# Altium project Analizador_trifasico_IoT_pcb.PrjPcb (part 1 of 2)
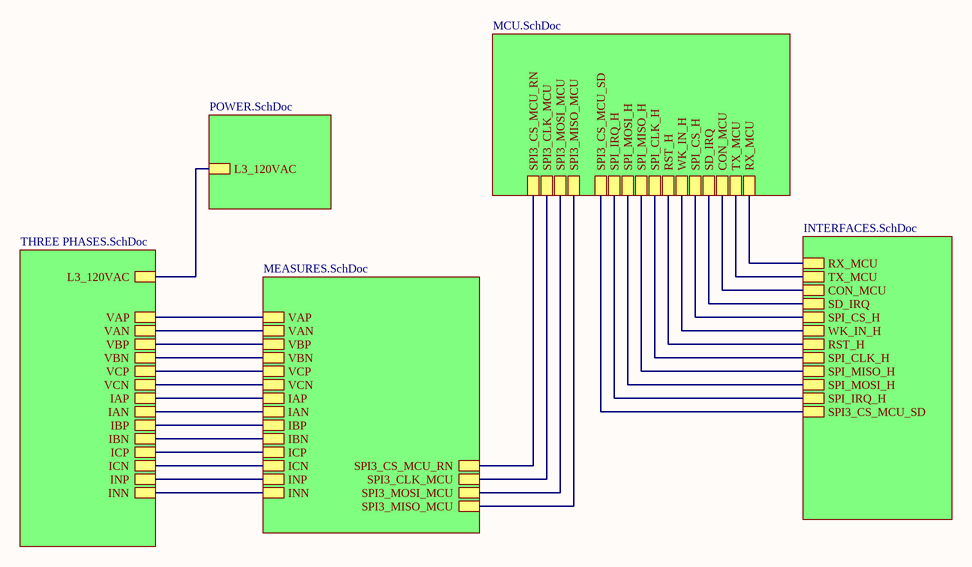
[diagram p0: MAIN.SchDoc]
6 sheets, 151 parts. Net scope: hierarchical (ports join the sheet entries above them; power ports are global).
Board file: Analizador_PCB.PcbDoc
Sheets:
  MAIN.SchDoc
    Designator = MEASURES.SchDoc
    Designator = POWER.SchDoc
    Designator = THREE PHASES.SchDoc
    Designator = MCU.SchDoc
    Designator = INTERFACES.SchDoc

## Sheet MAIN.SchDoc
size A4; SheetNumber: 1; SheetTotal: 6

### Sub-sheets
Designator = MEASURES.SchDoc: VAP, VAN, VBP, VBN, VCP, VCN, IAP, IAN, IBP, IBN, ICP, ICN, INP, INN, SPI3_MISO_MCU, SPI3_MOSI_MCU, SPI3_CLK_MCU, SPI3_CS_MCU_RN
Designator = POWER.SchDoc: L3_120VAC
Designator = THREE PHASES.SchDoc: VAP, VAN, VBP, VBN, VCP, VCN, IAP, IAN, IBP, IBN, ICP, ICN, INP, INN, L3_120VAC
Designator = MCU.SchDoc: SPI_IRQ_H, SPI_MOSI_H, SPI_MISO_H, SPI_CLK_H, RST_H, WK_IN_H, SPI_CS_H, CON_MCU, TX_MCU, RX_MCU, SPI3_CLK_MCU, SPI3_MOSI_MCU, SPI3_MISO_MCU, SD_IRQ, SPI3_CS_MCU_SD, SPI3_CS_MCU_RN
Designator = INTERFACES.SchDoc: TX_MCU, CON_MCU, RX_MCU, SPI_CS_H, SPI_MISO_H, WK_IN_H, RST_H, SPI_CLK_H, SPI_MOSI_H, SPI_IRQ_H, SD_IRQ, SPI3_CS_MCU_SD

### Nets
L3_120VAC: sheet Designator/L3_120VAC, sheet Designator/L3_120VAC
SPI_CLK_H: sheet Designator/SPI_CLK_H, sheet Designator/SPI_CLK_H
SPI_MISO_H: sheet Designator/SPI_MISO_H, sheet Designator/SPI_MISO_H
SPI_MOSI_H: sheet Designator/SPI_MOSI_H, sheet Designator/SPI_MOSI_H
Net500_1: sheet Designator/RST_H, sheet Designator/RST_H
Net500_2: sheet Designator/WK_IN_H, sheet Designator/WK_IN_H
Net500_3: sheet Designator/SPI_IRQ_H, sheet Designator/SPI_IRQ_H
Net500_4: sheet Designator/SPI_CS_H, sheet Designator/SPI_CS_H
NetC300_2: sheet Designator/IAP, sheet Designator/IAP
NetC301_1: sheet Designator/IAN, sheet Designator/IAN
NetC302_2: sheet Designator/VAP, sheet Designator/VAP
NetC303_1: sheet Designator/VAN, sheet Designator/VAN
NetC304_2: sheet Designator/IBP, sheet Designator/IBP
NetC305_1: sheet Designator/IBN, sheet Designator/IBN
NetC306_2: sheet Designator/VBP, sheet Designator/VBP
NetC307_1: sheet Designator/VBN, sheet Designator/VBN
NetC308_2: sheet Designator/ICP, sheet Designator/ICP
NetC309_2: sheet Designator/VCP, sheet Designator/VCP
NetC310_1: sheet Designator/ICN, sheet Designator/ICN
NetC311_1: sheet Designator/VCN, sheet Designator/VCN
NetC312_2: sheet Designator/INP, sheet Designator/INP
NetC313_1: sheet Designator/INN, sheet Designator/INN
NetR500_2: sheet Designator/CON_MCU, sheet Designator/CON_MCU
NetR503_1: sheet Designator/SPI3_CS_MCU_SD, sheet Designator/SPI3_CS_MCU_SD
NetR507_2: sheet Designator/SD_IRQ, sheet Designator/SD_IRQ
NetU101_3: sheet Designator/SPI3_MOSI_MCU, sheet Designator/SPI3_MOSI_MCU
NetU101_4: sheet Designator/SPI3_CS_MCU_RN, sheet Designator/SPI3_CS_MCU_RN
NetU101_5: sheet Designator/SPI3_CLK_MCU, sheet Designator/SPI3_CLK_MCU
NetU101_6: sheet Designator/SPI3_MISO_MCU, sheet Designator/SPI3_MISO_MCU
NetU401_10: sheet Designator/TX_MCU, sheet Designator/TX_MCU
NetU401_11: sheet Designator/RX_MCU, sheet Designator/RX_MCU

## Sheet MEASURES.SchDoc
size A4; SheetNumber: 4; SheetTotal: 6
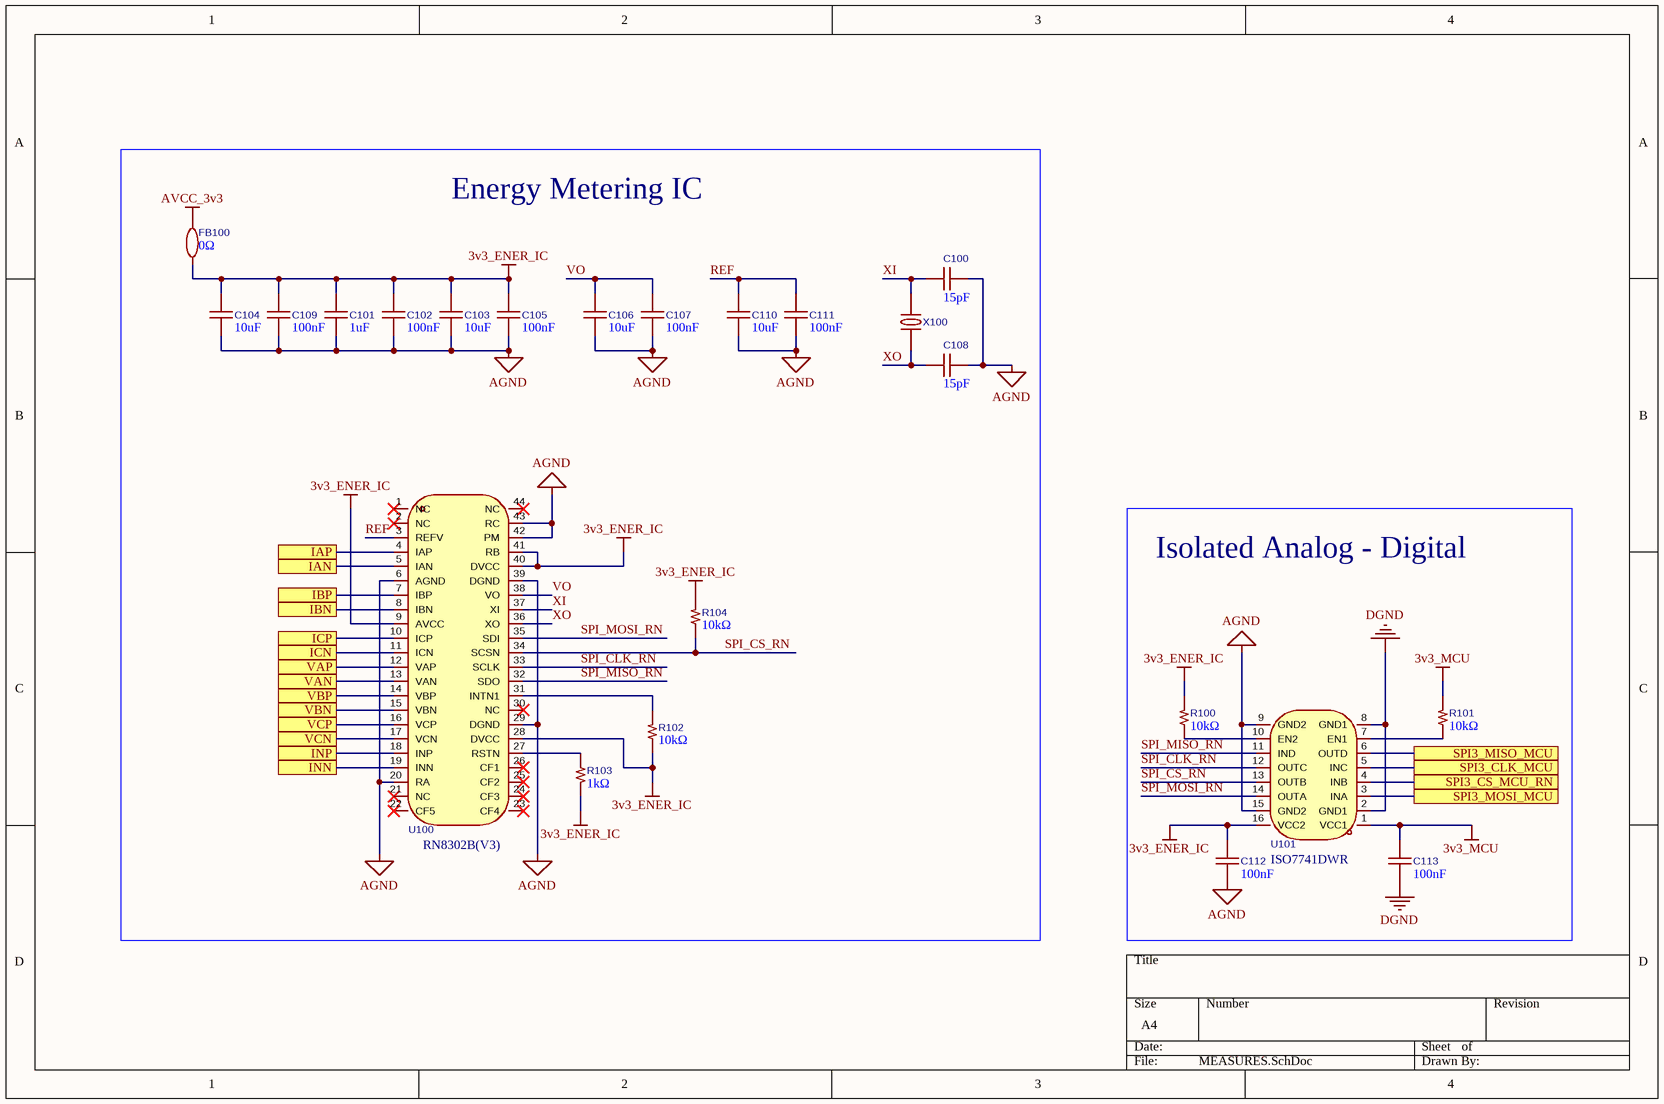
[diagram p1: MEASURES.SchDoc]

### Parts
C100  value 15pF  [0603_cap]  (hidden comment: YAGEO CC0603JRNPO9BN150)
C101  value 1uF  [0603_cap]  (hidden comment: CL10B105KB8NQNC)
C102  value 100nF  [0603_cap]  (hidden comment: AIDE CAPACITOR 0603X7R104K250NT)
C103  value 10uF  [0805_cap]  (hidden comment: muRata GRM21BR61C106KE15L)
C104  value 10uF  [0805_cap]  (hidden comment: muRata GRM21BR61C106KE15L)
C105  value 100nF  [0603_cap]  (hidden comment: AIDE CAPACITOR 0603X7R104K250NT)
C106  value 10uF  [0805_cap]  (hidden comment: muRata GRM21BR61C106KE15L)
C107  value 100nF  [0603_cap]  (hidden comment: AIDE CAPACITOR 0603X7R104K250NT)
C108  value 15pF  [0603_cap]  (hidden comment: YAGEO CC0603JRNPO9BN150)
C109  value 100nF  [0603_cap]  (hidden comment: AIDE CAPACITOR 0603X7R104K250NT)
C110  value 10uF  [0805_cap]  (hidden comment: muRata GRM21BR61C106KE15L)
C111  value 100nF  [0603_cap]  (hidden comment: AIDE CAPACITOR 0603X7R104K250NT)
C112  value 100nF  [0603_cap]  (hidden comment: AIDE CAPACITOR 0603X7R104K250NT)
C113  value 100nF  [0603_cap]  (hidden comment: AIDE CAPACITOR 0603X7R104K250NT)
FB100  value 0Ω  [0603_cap]  (hidden comment: Yanchuang SCBM160808U090T)
R100  value 10kΩ  [0603_RES]  (hidden comment: SAE 1RC0603F1002)
R101  value 10kΩ  [0603_RES]  (hidden comment: SAE 1RC0603F1002)
R102  value 10kΩ  [0603_RES]  (hidden comment: SAE 1RC0603F1002)
R103  value 1kΩ  [0603_RES]  (hidden comment: FOJAN FRC0603F1001TS)
R104  value 10kΩ  [0603_RES]  (hidden comment: SAE 1RC0603F1002)
U100  RN8302B(v3)  [3]
U101  C571196  [SOIC-16_L10.3-W7.5-P1.27-LS10.3-BL]  (value not drawn)
X100  049ss2-8.192f12dzlal  [HC-49S_L11.4-W4.7-LS12.7]  (value not drawn)

### Blocks framed on the sheet
Energy Metering IC: C100-C111 FB100 R102-R104 U100 X100
Isolated Analog - Digital: C112 C113 R100 R101 U101

### Ports
IAN (see MAIN[2C], THREE PHASES[4B]), IAP (see MAIN[2C], THREE PHASES[4A]), IBN (see MAIN[2C], THREE PHASES[4B]), IBP (see MAIN[2C], THREE PHASES[4B]), ICN (see MAIN[2C], THREE PHASES[4C]), ICP (see MAIN[2C], THREE PHASES[4C]), INN (see MAIN[2C], THREE PHASES[4D]), INP (see MAIN[2C], THREE PHASES[4C]), SPI3_CLK_MCU (see MAIN[2C], MCU[3C]), SPI3_CS_MCU_RN (see MAIN[2C], MCU[3C]), SPI3_MISO_MCU (see MAIN[2C], MCU[3C]), SPI3_MOSI_MCU (see MAIN[2C], MCU[3C]), VAN (see MAIN[2B], THREE PHASES[3B]), VAP (see MAIN[2B], THREE PHASES[3B]), VBN (see MAIN[2B], THREE PHASES[3C]), VBP (see MAIN[2B], THREE PHASES[3B]), VCN (see MAIN[2B], THREE PHASES[3C]), VCP (see MAIN[2B], THREE PHASES[3C])

### Nets
3v3_ENER_IC: C101.2 C102.2 C103.2 C104.2 C105.2 C109.2 C112.2 FB100.1 R100.2 R102.1 R103.2 R104.2 U100.9(AVCC) U100.28(DVCC) U100.40(DVCC) U100.41(RB) U101.16(VCC2)
3v3_MCU: C113.2 R101.2 U101.1(VCC1)
AGND: C100.1 C101.1 C102.1 C103.1 C104.1 C105.1 C106.1 C107.1 C108.1 C109.1 C110.1 C111.1 C112.1 U100.6(AGND) U100.20(RA) U100.29(DGND) U100.39(DGND) U100.42(PM) U100.43(RC) U101.9(GND2) U101.15(GND2)
AVCC_3v3: FB100.2
DGND: C113.1 U101.2(GND1) U101.8(GND1)
REF: C110.2 C111.2 U100.3(REFV)
SPI_CLK_RN: U100.33(SCLK) U101.12(OUTC)
SPI_CS_RN: R104.1 U100.34(SCSN) U101.13(OUTB)
SPI_MISO_RN: U100.32(SDO) U101.11(IND)
SPI_MOSI_RN: U100.35(SDI) U101.14(OUTA)
VO: C106.2 C107.2 U100.38(VO)
XI: C100.2 U100.37(XI) X100.1
XO: C108.2 U100.36(XO) X100.2
NetC300_2: U100.4(IAP) ; port IAP
NetC301_1: U100.5(IAN) ; port IAN
NetC302_2: U100.12(VAP) ; port VAP
NetC303_1: U100.13(VAN) ; port VAN
NetC304_2: U100.7(IBP) ; port IBP
NetC305_1: U100.8(IBN) ; port IBN
NetC306_2: U100.14(VBP) ; port VBP
NetC307_1: U100.15(VBN) ; port VBN
NetC308_2: U100.10(ICP) ; port ICP
NetC309_2: U100.16(VCP) ; port VCP
NetC310_1: U100.11(ICN) ; port ICN
NetC311_1: U100.17(VCN) ; port VCN
NetC312_2: U100.18(INP) ; port INP
NetC313_1: U100.19(INN) ; port INN
NetR100_1: R100.1 U101.10(EN2)
NetR101_1: R101.1 U101.7(EN1)
NetR102_2: R102.2 U100.31(INTN1)
NetR103_1: R103.1 U100.27(RSTN)
NetU101_3: U101.3(INA) ; port SPI3_MOSI_MCU
NetU101_4: U101.4(INB) ; port SPI3_CS_MCU_RN
NetU101_5: U101.5(INC) ; port SPI3_CLK_MCU
NetU101_6: U101.6(OUTD) ; port SPI3_MISO_MCU

Not connected (* = marked no-connect by the designer): U100 1(NC)* 2(NC)* 21(NC)* 22(CF5)* 23(CF4)* 24(CF3)* 25(CF2)* 26(CF1)* 30(NC)* 44(NC)*

### Library data of the parts
C100 C108 = CAP CER 15pF 50V NP0 0603: Capacitance:15pF Tolerance:±5% Tolerance:±5% Voltage Rating:50V Temperature Coefficient:C0G; Manufacturer 1: Chinocera; Manufacturer Part Number 1: HGC0603G0150J500NTHJ; ComponentLink1Description: LCSC; ComponentLink1URL: https://www.lcsc.com/product-detail/C465156.html?s_z=n_q_HGC0603G0150J500NTHJ; Supplier 1: LCSC; Supplier Part Number 1: C465156
C101 = CAP CER 1uF 50V X7R 0603: Capacitance:1uF Tolerance:±20% Tolerance:±20% Voltage Rating:50V Ripple Current:- Equivalent Series Resistance(ESR):- Diameter:4mm Height - Seated (Max):5.4mm Lifetime:1000hrs@105℃ Operating Temperature:-45℃~+105℃ Operating Temperature:-45℃~+105℃; Manufacturer 1: Samsung Electro-Mechanics; ComponentLink1Description: LCSC; ComponentLink1URL: https://www.lcsc.com/es/product-detail/C5199872.html?spm=wm.fly.bg.9.xh&lcsc_vid=ElBYBFACR1JaVQdSQ1NeBFwHFAdfUFIFEwUNXlwCEVQxVlNfRlVWUFNWT1hWUDtW; Supplier 1: LSCS; Supplier Part Number 1: C5199872; Manufacturer Part Number 1: CL10B105KB8NQNC
C102 C105 C107 C109 C111-C113 = CAP CER 100nF 25V X7R 0603: ComponentLink1Description: LCSC; ComponentLink1URL: https://www.lcsc.com/product-detail/C465156.html?s_z=n_q_HGC0603G0150J500NTHJ; Supplier 1: LCSC; Manufacturer 1: AIDE CAPACITOR; Manufacturer Part Number 1: 0603X7R104K250NT; Supplier Part Number 1: C48579280
C103 C104 C106 C110 = CAP CER 10uF 16V X5R 0805: ComponentLink1Description: New link; ComponentLink1URL: https://www.lcsc.com/es/product-detail/C77075.html?spm=wm.fly.bg.11.xh___wm.fly.dhl.mly.13-0-3&lcsc_vid=ElBYBFACR1JaVQdSQ1NeBFwHFAdfUFIFEwUNXlwCEVQxVlNfRlVWUFNWT1hWUDtW; Manufacturer 1: muRata; Manufacturer Part Number 1: GRM21BR61C106KE15L; Supplier Part Number 1: C77075; Supplier 1: LCSC
FB100 = FERR_10mohms 15o@100MHz: 10mΩ 15Ω@100MHz 0603 Ferrite Beads and Chips; ComponentLink1Description: LCSC; ComponentLink1URL: https://www.lcsc.com/es/product-detail/C52205324.html?s_z=s_c_Ferrite%2520Beads%2520and%2520Chips&spm=wm.fly.bg.0.xh&lcsc_vid=T1EMUlBeR1ALUlVSFANeUFcFR1BWV1EHFVFaA1dQElAxVlNfRlJaVFNSQlhYUjsOAxUeFF5JWBYZEEoKFBINSQcJGk4LFEsFFhULAAsUDk5fVlNWWQkaCgg%3D; Supplier 1: LCSC; Supplier Part Number 1: C52205324; Manufacturer 1: Yanchuang; Manufacturer Part Number 1: SCBM160808U090T
R100-R102 R104 = RES_10kohms 100mW 75V: 10kΩ 100mW 75V Thick Film Resistor ±100ppm/℃ ±1% 0603 Chip Resistor - Surface Mount; ComponentLink1Description: New link; ComponentLink1URL: https://www.lcsc.com/es/product-detail/C53224186.html?spm=wm.fly.bg.4.xh___wm.fly.dhl.mly.13-6-1&lcsc_vid=T1EMUlBeR1ALUlVSFANeUFcFR1BWV1EHFVFaA1dQElAxVlNfRlJaV1FUQldbXzsOAxUeFF5JWBYZEEoKFBINSQcJGk4NBhYS; Manufacturer 1: SAE; Manufacturer Part Number 1: 1RC0603F1002; Supplier Part Number 1: C53224186; Supplier 1: LCSC
R103 = RES 1kohms ±1% 100mW 0603: RES 1kΩ ±1% 100mW 0603; ComponentLink1Description: New link; ComponentLink1URL: https://www.lcsc.com/es/product-detail/C2907002.html?spm=wm.fly.bg.1.xh___wm.fly.dhl.mly.13-6-1&lcsc_vid=T1EMUlBeR1ALUlVSFANeUFcFR1BWV1EHFVFaA1dQElAxVlNfRlJaV1FUQldbXzsOAxUeFF5JWBYZEEoKFBINSQcJGk4NBhYS; Supplier 1: LCSC; Supplier Part Number 1: C2907002; Manufacturer Part Number 1: FRC0603F1001TS; Manufacturer 1: FOJAN
U100 = RN8302B(v3): Meter Type:Polyphase Energy Metering IC Number of Channels:- Tolerance:0.1% Voltage - Supply:3V~3.6V Voltage - Supply:3V~3.6V Dynamic Range:10000:1 Interface:SPI Current - Supply:4.4mA Current - Supply:4.4mA Operating Temperature:-40℃~+85℃ Operating Tempe; Manufacturer 1: RENERGY; ComponentLink1Description: LCSC; ComponentLink1URL: https://www.lcsc.com/es/product-detail/C22381391.html?s_z=n_q_rn8302b%28v3%29&spm=wm.fly.bg.0.xh&lcsc_vid=FFRdVwAETgNbVwAHTlRdV1UFEwcIU1ZXQVZZAlYFQAcxVlNfRlJdUlFTRVNXXzsOAxUeFF5JWBYZEEoKFBINSQcJGk4LFEsWBQ4KEgcSWgULEwUPG04tU1VSTllfSQwSGg0%3D; Supplier 1: LCSC; Supplier Part Number 1: C22381391; Manufacturer Part Number 1: RN8302B(V3)
U101 = iso7741dwr: Number of Forward Channels:3 Number of Reverse Channels:1 Data Rate(Max):100Mbps Default Output:High Level Isolation Voltage(Vrms):5000 CMTI(kV/us):100kV/us Propagation Delay(tpd):10.7ns Features:Channel direction configurable；Fail-safe output Voltage - S; Manufacturer 1: TI; ComponentLink1Description: LCSC; ComponentLink1URL: https://www.lcsc.com/es/product-detail/C571196.html?s_z=n_q_iso7741dwr&spm=wm.fly.bg.0.xh&lcsc_vid=FFRdVwAETgNbVwAHTlRdV1UFEwcIU1ZXQVZZAlYFQAcxVlNfRlJdUlZUQVBeVTsOAxUeFF5JWBYZEEoKFBINSQcJGk4LFEsWBQ4KEgcSWgULEwUPG04tUlZRQ1deXlZIHxUDCw%3D%3D; Supplier 1: LCSC; Supplier Part Number 1: C571196; Manufacturer Part Number 1: ISO7741DWR
X100 = Crystal_049ss2: Type:Crystal Oscillator Frequency:8.192MHz Normal temperature Frequency Tolerance:±20ppm Normal temperature Frequency Tolerance:±20ppm Load Capacitance:12pF Frequency Stability:±100ppm Frequency Stability:±100ppm Equivalent Series Resistance(ESR):60Ω Oper; Manufacturer 1: HCI; Value: 8.192MHz; Operating Temperature: -40℃~+125℃; ComponentLink1Description: LCSC; ComponentLink1URL: https://www.lcsc.com/es/product-detail/C19674267.html?s_z=n_q_049ss2-8.192f12dzlal&spm=wm.fly.bg.0.xh&lcsc_vid=FFRdVwAETgNbVwAHTlRdV1UFEwcIU1ZXQVZZAlYFQAcxVlNfRlJdU11WRldaVDsOAxUeFF5JWBYZEEoKFBINSQcJGk4LFEsWBQ4KEgcSWgULEwUPG04tUFBVQVZZVEoOAwwC; Supplier 1: LCSC; Supplier Part Number 1: C19674267; Manufacturer Part Number 1: 049SS2-8.192F12DZLAL

## Sheet POWER.SchDoc
size A4; SheetNumber: 3; SheetTotal: 6
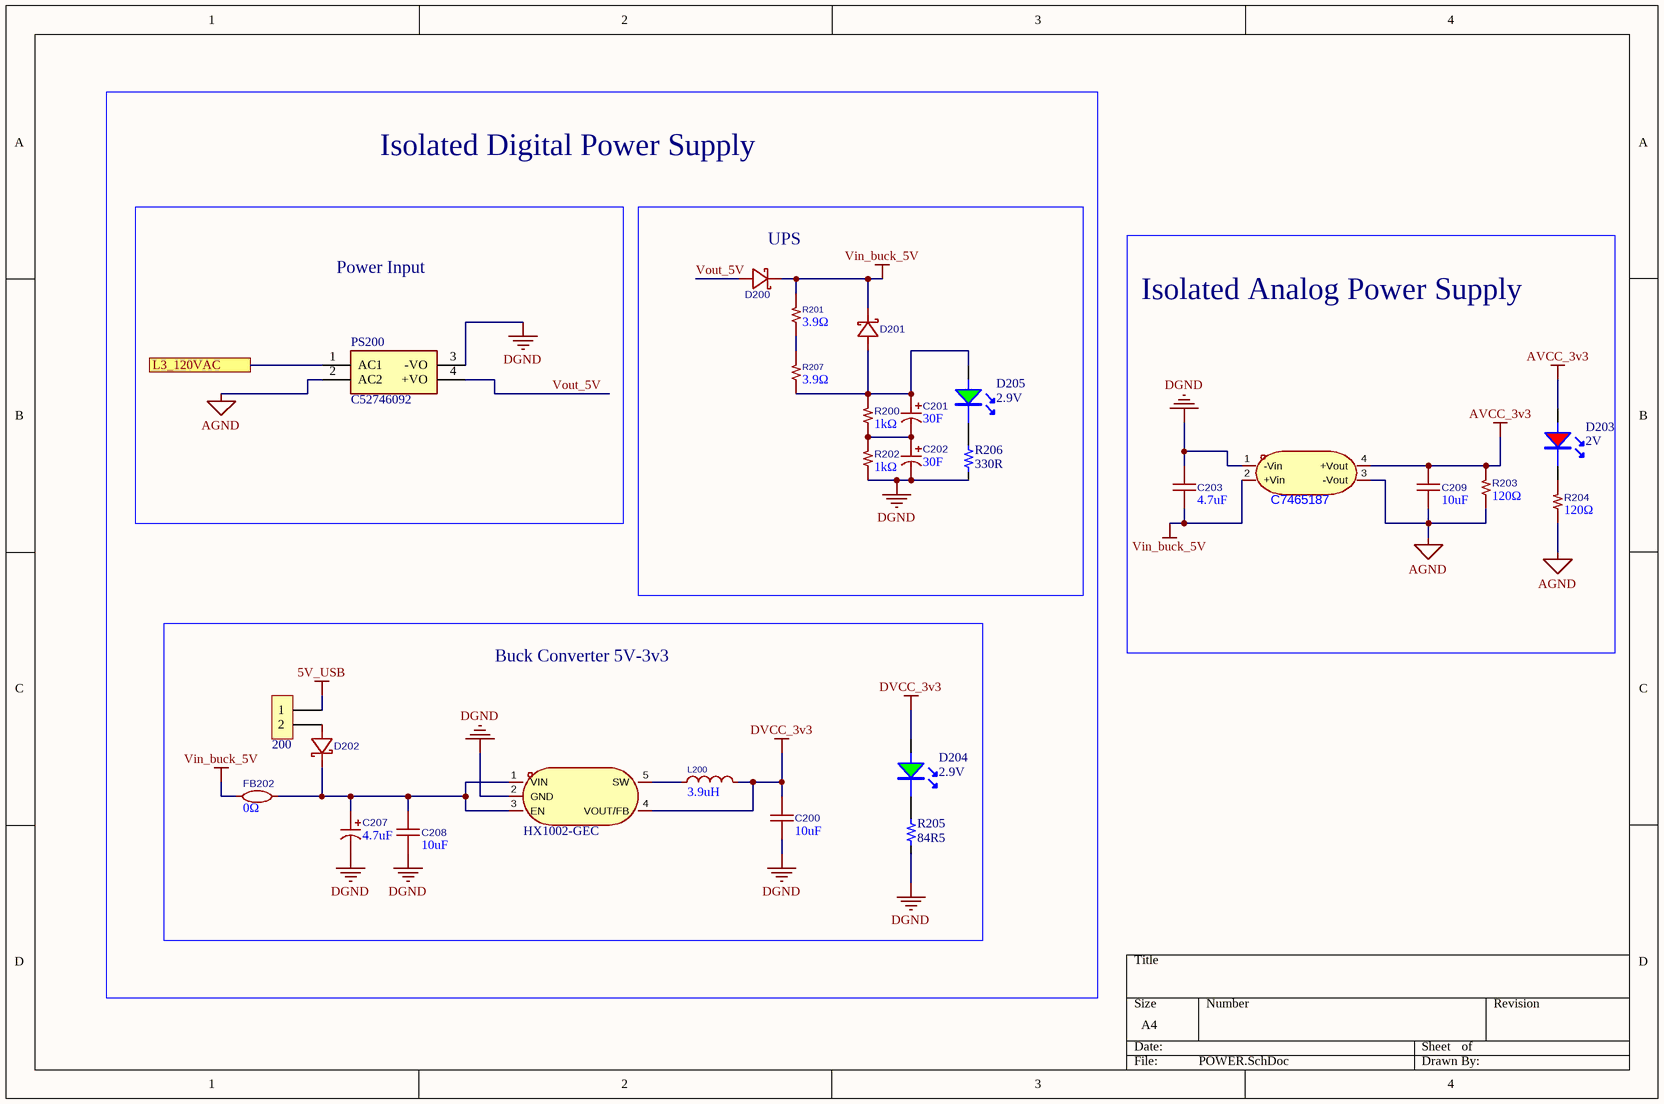
[diagram p2: POWER.SchDoc]

### Parts
200  2x1  [H_2x1_TH_100mil]  (value not drawn)  (no BOM)
C200  value 10uF  [0805_cap]  (hidden comment: muRata GRM21BR61C106KE15L)
C201  value 30F  [CAP-TH_BD18.0-P7.50-D0.8-FD-H26.0]  (hidden comment: hp-2r7-j306vyj23)
C202  value 30F  [CAP-TH_BD18.0-P7.50-D0.8-FD-H26.0]  (hidden comment: hp-2r7-j306vyj23)
C203  value 4.7uF  [0603_cap]  (hidden comment: Samsung Electro-Mechanics)
C207  value 4.7uF  [CAP-SMD_BD4.0-L4.3-W4.3-FD]  (hidden comment: rvt1e4r7m0405)
C208  value 10uF  [0805_cap]  (hidden comment: muRata GRM21BR61C106KE15L)
C209  value 10uF  [0805_cap]  (hidden comment: muRata GRM21BR61C106KE15L)
D200  ms2a40lws  [SMA_L4.4-W2.8-LS5.4-RD]  (value not drawn)
D201  ms2a40lws  [SMA_L4.4-W2.8-LS5.4-RD]  (value not drawn)
D202  ms2a40lws  [SMA_L4.4-W2.8-LS5.4-RD]  (value not drawn)
D203  2V  [0805_LED]
D204  2.9V  [0805_LED]
D205  2.9V  [0805_LED]
FB202  value 0Ω  [0603_cap]  (hidden comment: Yanchuang SCBM160808U090T)
L200  value 3.9uH  [IND-SMD_L4.0-W4.0_VLCF4028T]  (hidden comment: znr4030st3r9m)
PS200  C52746092  [CONV_HLK-10M05]
R200  value 1kΩ  [0603_RES]  (hidden comment: FOJAN FRC0603F1001TS)
R201  value 3.9Ω  [R2512]  (hidden comment: RES 3900mΩ ±5% 2W 2512)
R202  value 1kΩ  [0603_RES]  (hidden comment: FOJAN FRC0603F1001TS)
R203  value 120Ω  [0603_RES]  (hidden comment: HWA CHN HRC0603F1200ENTN)
R204  value 120Ω  [0603_RES]  (hidden comment: RES 120Ω ±1% 100mW 0603)
R205  value 84R5  [0603_RES]  (hidden comment: 84R5 1/10W)
R206  value 330R  [0603_res]  (hidden comment: 330R 1/10W)
R207  value 3.9Ω  [R2512]  (hidden comment: RES 3900mΩ ±5% 2W 2512)
U200  hx1002-gec  [SOT-23-5_L2.9-W1.6-P0.95-LS2.9-BL]
U202  Supplier Part Number 1: C7465187  [PWRM-TH_B0503S-1WR2]  (hidden comment: b0503s-1wr3_c7465187)

### Blocks framed on the sheet
Power Input: PS200
UPS: C201 C202 D200 D201 D205 R200-R202 R206 R207
Isolated Analog Power Supply: C203 C209 D203 R203 R204 U202
Buck Converter 5V-3v3: 200 C200 C207 C208 D202 D204 FB202 L200 R205 U200

### Ports
L3_120VAC (see MAIN[2B], THREE PHASES[1C])

### Nets
5V_USB: 200.1
AGND: C209.1 PS200.2(AC2) R203.1 R204.1 U202.3(-Vout)
AVCC_3v3: C209.2 D203.1(A) R203.2 U202.4(+Vout)
DGND: C200.1 C202.2 C203.2 C207.2 C208.1 PS200.3(-VO) R202.1 R205.1 R206.1 U200.2(GND) U202.1(-Vin)
DVCC_3v3: C200.2 D204.1(A) L200.2 U200.4(VOUT/FB)
Vin_buck_5V: C203.1 D200.1(K) D201.1(K) FB202.2 R201.2 U202.2(+Vin)
L3_120VAC: PS200.1(AC1) ; port L3_120VAC
Vout_5V: D200.2(A) PS200.4(+VO)
Net200_2: 200.2 D202.2(A)
NetC201_1: C201.1 D201.2(A) D205.1(A) R200.2 R207.1
NetC201_2: C201.2 C202.1 R200.1 R202.2
NetC207_1: C207.1 C208.2 D202.1(K) FB202.1 U200.1(VIN) U200.3(EN)
NetD203_2: D203.2 R204.2
NetD204_2: D204.2 R205.2
NetD205_2: D205.2 R206.2
NetL200_1: L200.1 U200.5(SW)
NetR201_1: R201.1 R207.2

### Notes on the sheet
- Isolated Digital Power Supply

### Library data of the parts
200 = H_Male_2x1_TH_100mil: ComponentLink1Description: LCSC
C200 C208 C209 = CAP CER 10uF 16V X5R 0805: ComponentLink1Description: New link; ComponentLink1URL: https://www.lcsc.com/es/product-detail/C77075.html?spm=wm.fly.bg.11.xh___wm.fly.dhl.mly.13-0-3&lcsc_vid=ElBYBFACR1JaVQdSQ1NeBFwHFAdfUFIFEwUNXlwCEVQxVlNfRlVWUFNWT1hWUDtW; Manufacturer 1: muRata; Manufacturer Part Number 1: GRM21BR61C106KE15L; Supplier Part Number 1: C77075; Supplier 1: LCSC
C201 C202 = CAP_ELEC_30F_TH: Capacitance:30F Tolerance:0%~+30% Tolerance:0%~+30% Voltage Rating:2.7V Pin Spacing:7.5mm Diameter:18mm Height - Seated (Max):26mm Operating Temperature:-40℃~+70℃ Operating Temperature:-40℃~+70℃; Manufacturer 1: KAMCAP; ComponentLink1Description: LCSC; ComponentLink1URL: https://www.lcsc.com/product-detail/C7436773.html?s_z=n_q_HP-2R7-J306VYJ23; Supplier 1: LCSC; Manufacturer Part Number 1: HP-2R7-J306VYJ23; Supplier Part Number 1: C7436773
C203 = CAP CER 4.7uF 16V X5R 0603: Manufacturer Part Number 1: CL10A475KO8NNNC; ComponentLink1Description: New link; ComponentLink1URL: https://www.lcsc.com/es/product-detail/C19666.html?spm=wm.fly.bg.0.xh___wm.fly.tp.3.ml&lcsc_vid=T1JZUwUCEwNbBlAHEwBdAVwDRAQPAV1eEVFfVgECQlMxVlNfRFdeV1BRRFhaUzsOAxUeFF5JWBYZEEoKFBINSQcJGk4LFEsFFhULAAsUDk5dV0oOAwwC; Manufacturer 1: Samsung Electro-Mechanics; Supplier Part Number 1: C19666; Supplier 1: LCSC
C207 = CAP_AL_4.7uF_SMD: Capacitance:4.7uF Tolerance:±20% Tolerance:±20% Voltage Rating:25V Diameter:4mm Height - Seated (Max):5.4mm Operating Temperature:-40℃~+105℃ Operating Temperature:-40℃~+105℃; Manufacturer 1: ROQANG; ComponentLink1Description: LCSC; ComponentLink1URL: https://www.lcsc.com/es/product-detail/C41435083.html?s_z=n_q_t_capacitor&spm=wm.fly.bg.1.xh___wm.ssy.tc.4.tz&lcsc_vid=T1EMUlBeR1ALUlVSFANeUFcFR1BWV1EHFVFaA1dQElAxVlNfRlJaV1FUQldbXzsOAxUeFF5JWBYZEEoKFBINSQcJGk4NBhYS; Supplier 1: LCSC; Manufacturer Part Number 1: RVT1E4R7M0405; Supplier Part Number 1: C41435083
D200-D202 = DIOD_SHOT_2A: 30V 1 Independent 125mV@1mA 1.5A SOD-123F Single Diodes RoHS; Manufacturer 1: onsemi; Manufacturer Part Number 1: MBRA210LT3G; ComponentLink1Description: LCSC; ComponentLink1URL: https://www.lcsc.com/product-detail/C145190.html; Supplier 1: LCSC; Supplier Part Number 1: C145190
D203 = LED_0805_RED: LED RED CLEAR 0805 SMD; Manufacturer: XINGLIGHT; Manufacturer Part Number: XL-2012SURC; Supplier 1: LCSC; Supplier Part Number 1: C965812; ComponentLink1Description: LCSC; ComponentLink1URL: https://www.lcsc.com/product-detail/Light-Emitting-Diodes-LED_XINGLIGHT-XL-2012SURC_C965812.html
D204 D205 = LED_0805_Green: LED GREEN CLEAR 0805 SMD; Manufacturer: XINGLIGHT; Manufacturer Part Number: XL-2012UGC; Supplier 1: LCSC; Supplier Part Number 1: C965815; ComponentLink1Description: LCSC; ComponentLink1URL: https://www.lcsc.com/product-detail/Light-Emitting-Diodes-LED_XINGLIGHT-XL-2012UGC_C965815.html
FB202 = FERR_10mohms 15o@100MHz: as FB100 on sheet MEASURES; ComponentLink1Description: LCSC; ComponentLink1URL: https://www.lcsc.com/es/product-detail/C52205324.html?s_z=s_c_Ferrite%2520Beads%2520and%2520Chips&spm=wm.fly.bg.0.xh&lcsc_vid=T1EMUlBeR1ALUlVSFANeUFcFR1BWV1EHFVFaA1dQElAxVlNfRlJaVFNSQlhYUjsOAxUeFF5JWBYZEEoKFBINSQcJGk4LFEsFFhULAAsUDk5fVlNWWQkaCgg%3D; Supplier 1: LCSC; Supplier Part Number 1: C52205324; Manufacturer 1: Yanchuang; Manufacturer Part Number 1: SCBM160808U090T
L200 = IND 3.9uH 2.3A 57mohms: Inductance:3.9uH Tolerance:±20% Tolerance:±20% Current Rating:2.3A Current - Saturation(Isat):3.3A DC Resistance(DCR):57mΩ Type:Magnetic Shielded Inductor; Manufacturer 1: ZE; ComponentLink1Description: LCSC; ComponentLink1URL: https://www.lcsc.com/product-detail/C42429307.html?s_z=n_q_ZNR4030ST3R9M; Supplier 1: LCSC; Manufacturer Part Number 1: ZNR4030ST3R9M; Supplier Part Number 1: C42429307
PS200 = HLK-10M05: 10W Ultra-Compact Power Module; Manufacturer 1: HI-LINK; Manufacturer Part Number 1: HLK-10M05T; Value: HI_LINK_5V; ComponentLink1Description: LCSC; ComponentLink1URL: https://www.lcsc.com/es/product-detail/C52746092.html?s_z=n_q_HLK-10M05&spm=wm.fly.bg.1.xh&lcsc_vid=FFRdVwAETgNbVwAHTlRdV1UFEwcIU1ZXQVZZAlYFQAcxVlNfRlJdUlVUT1RdXzsOAxUeFF5JWBYZEEoKFBINSQcJGk4LFEsWBQ4KEgcSWgULEwUPG04tVVxVQFFXVUoOAwwC; Supplier 1: LCSC; Supplier Part Number 1: C52746092
R200 R202 = RES 1kohms ±1% 100mW 0603: RES 1kΩ ±1% 100mW 0603; ComponentLink1Description: New link; ComponentLink1URL: https://www.lcsc.com/es/product-detail/C2907002.html?spm=wm.fly.bg.1.xh___wm.fly.dhl.mly.13-6-1&lcsc_vid=T1EMUlBeR1ALUlVSFANeUFcFR1BWV1EHFVFaA1dQElAxVlNfRlJaV1FUQldbXzsOAxUeFF5JWBYZEEoKFBINSQcJGk4NBhYS; Supplier 1: LCSC; Supplier Part Number 1: C2907002; Manufacturer Part Number 1: FRC0603F1001TS; Manufacturer 1: FOJAN
R201 R207 = RES 3900mohms ±5% 2W 2512: Type:Thick Film Resistor Resistance:3.9Ω Tolerance:±5% Tolerance:±5% Power(Watts):2W Voltage-Supply(Max):300V Operating Temperature:-55℃~+155℃ Operating Temperature:-55℃~+155℃; Manufacturer 1: UNI-ROYAL; Manufacturer Part Number 1: HP122WJ039JT4E; Supplier Part Number 1: C2758800; Supplier 1: LCSC; ComponentLink1Description: New link; ComponentLink1URL: https://www.lcsc.com/product-detail/C2758800.html?s_z=n_q_RES%25203900m%25CE%25A9%2520%25C2%25B15%2525%25202W%25202512&spm=wm.fly.bg.0.xh&lcsc_vid=FgNcU1VVElNeBldeQQRZX1dUEQNWVQcHT1lYV11XRlMxVlNfQ1ZbX1xVRlddXjsOAxUeFF5JWBYZEEoKFBINSQcJGk4dAgUUFAk%3D
R203 = RES_120ohms 50V: 100mW 120 50V Thick Film Resistor ±1% ±100ppm/℃ 0603 Chip Resistor - Surface Mount; Manufacturer 1: HWA CHN; Manufacturer Part Number 1: HRC0603F1200ENTNV; ComponentLink1Description: New link; ComponentLink1URL: https://www.lcsc.com/es/product-detail/C54920849.html?spm=wm.fly.bg.0.xh___wm.fly.dhl.mly.13-6-1&lcsc_vid=T1EMUlBeR1ALUlVSFANeUFcFR1BWV1EHFVFaA1dQElAxVlNfRlJaV1FUQldbXzsOAxUeFF5JWBYZEEoKFBINSQcJGk4NBhYS; Supplier Part Number 1: C54920849; Supplier 1: LCSC
R204 = RES 120ohms 100mW150V Thick Film Resistor  ±100ppm 0805: Manufacturer 1: HWA CHN; Manufacturer Part Number 1: HRC0805F1200FNTN; ComponentLink1Description: New link; ComponentLink1URL: https://www.lcsc.com/product-detail/C48996813.html; Supplier Part Number 1: C54921099; Supplier 1: LCSC
R205 = Res_84R5_0603_1/10W: 100mW Thick Film Resistor 50V ±100ppm/℃ ±1% 84.5Ω 0603 Chip Resistor - Surface Mount ROHS; Manufacturer: LIZ Elec; Manufacturer Part Number: CR0603FA84R5G; ComponentLink1URL: https://lcsc.com/product-detail/Chip-Resistor-Surface-Mount_LIZ-Elec-CR0603FA84R5G_C101216.html; Supplier 1: LCSC; Supplier Part Number 1: C101216; ComponentLink1Description: LCSC
R206 = Res_330R_0603_1/10W: RES SMD 330R OHM 5% 1/10W 0603; Manufacturer: FOJAN; Manufacturer Part Number: FRC0603J331 TS; ComponentLink1URL: https://www.lcsc.com/product-detail/Chip-Resistor-Surface-Mount_FOJAN-FRC0603J331-TS_C2907152.html; Supplier 1: LCSC; Supplier Part Number 1: C2907152; ComponentLink1Description: LCSC
U200 = hx1002-gec: Function:Step-down type Voltage - Supply:3.4V~5.5V Voltage - Supply:3.4V~5.5V Output Voltage:3.3V Output Voltage:3.3V Output Current:1.3A Frequency - Switching:1MHz Frequency - Switching:1MHz Operating Temperature:-40℃~+85℃@(TA) Operating Temperature:-40℃; Manufacturer 1: HEXIN; Manufacturer Part Number 1: HX1002-GEC; Supplier 1: LCSC; Supplier Part Number 1: C47115461; ComponentLink1Description: New link; ComponentLink1URL: https://www.lcsc.com/product-detail/C47115461.html?s_z=n_q_HX1002-GEC&spm=wm.fly.bg.0.xh&lcsc_vid=FgNcU1VVElNeBldeQQRZX1dUEQNWVQcHT1lYV11XRlMxVlNfQ1ZbXlRTRVZbVjsOAxUeFF5JWBYZEEoKFBINSQcJGk4eFQsCAgIaSgADAwAHC0slRVZbX1xWR08GEwkK
U202 = b0503s-1wr3_c7465187: Type:Plastic encapsulated type Number of Outputs:1 Output Power:1W Voltage - Supply:4.5V~5.5V Voltage - Supply:4.5V~5.5V Conversion Efficiency:74% Conversion Efficiency:74% Output Voltage:3.3V Output Voltage:3.3V Output Current(Max):303mA Output Current(M; Manufacturer 1: EVISUN(易成); Manufacturer Part Number 1: B0503S-1WR3; Supplier 1: LCSC; ComponentLink1Description: LCSC; ComponentLink1URL: https://www.lcsc.com/product-detail/C7465187.html?s_z=n_q_p_b0503s-1wr3_c7465187

## Sheet THREE PHASES.SchDoc
size A4; SheetNumber: 2; SheetTotal: 6
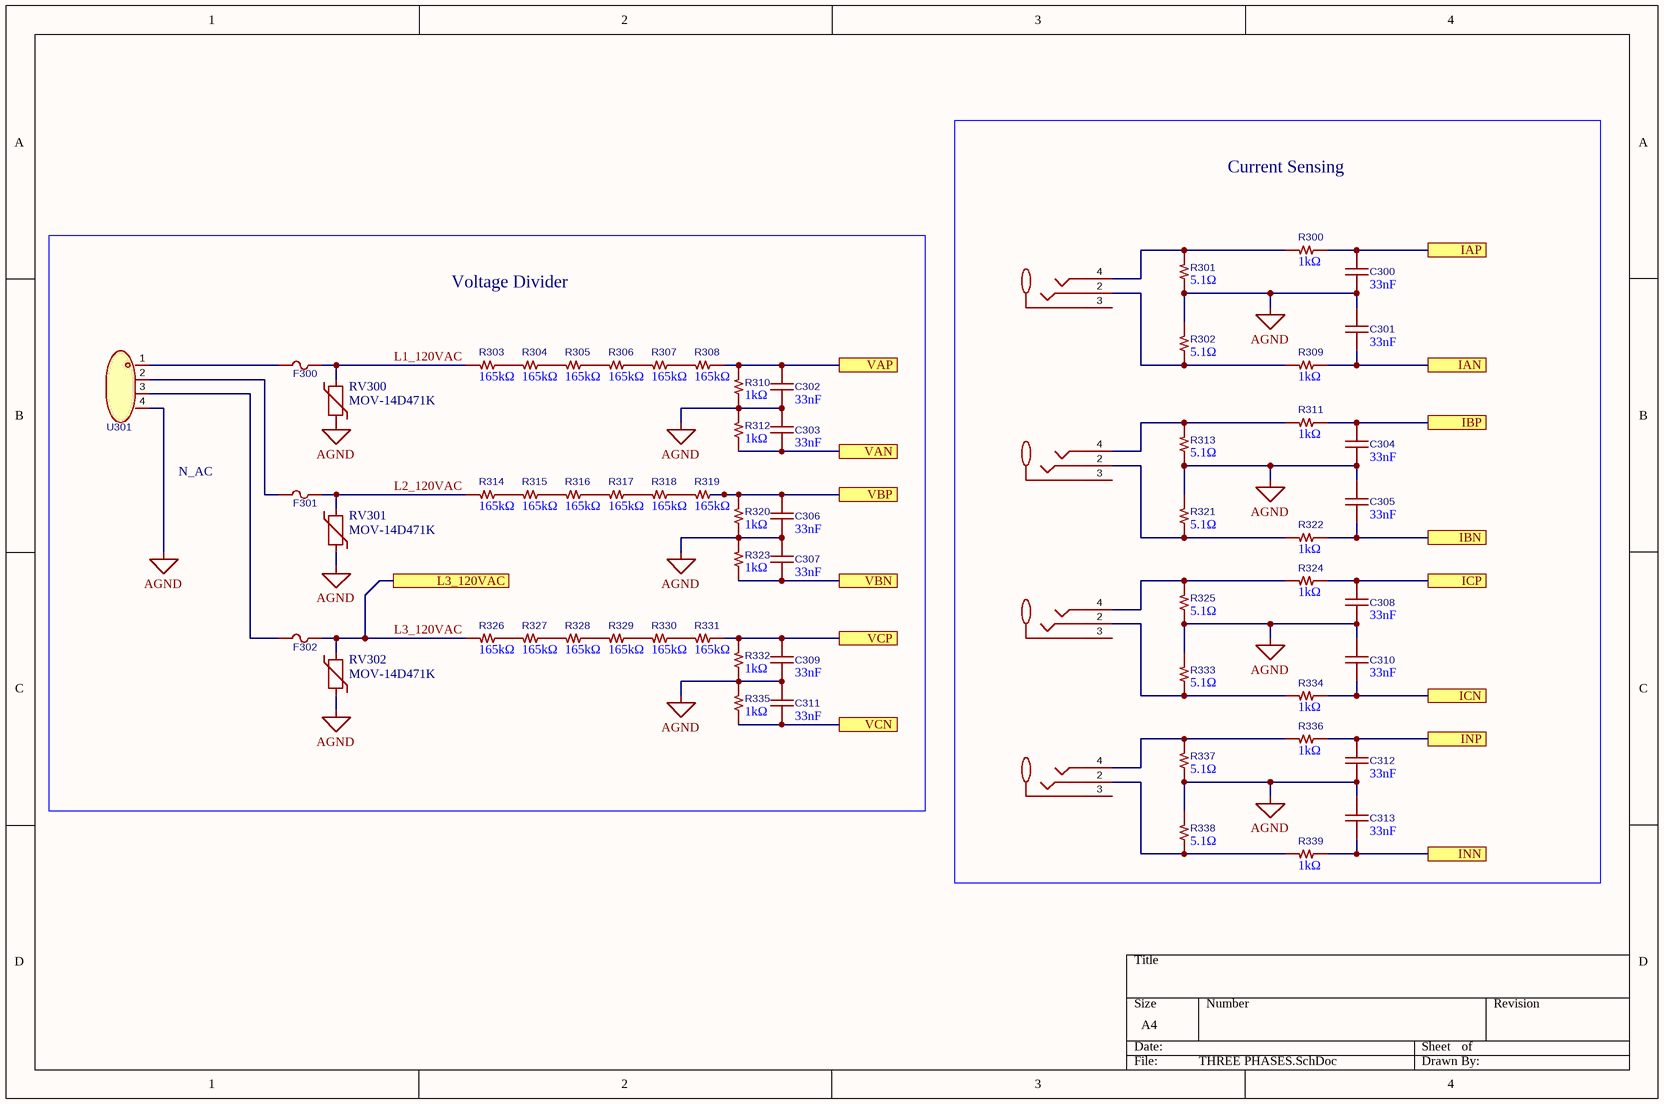
[diagram p3: THREE PHASES.SchDoc]

### Parts
C300  value 33nF  [0603_cap]  (hidden comment: AIDE CAPACITOR 0603X7R333J500NT)
C301  value 33nF  [0603_cap]  (hidden comment: AIDE CAPACITOR 0603X7R333J500NT)
C302  value 33nF  [0603_cap]  (hidden comment: AIDE CAPACITOR 0603X7R333J500NT)
C303  value 33nF  [0603_cap]  (hidden comment: AIDE CAPACITOR 0603X7R333J500NT)
C304  value 33nF  [0603_cap]  (hidden comment: AIDE CAPACITOR 0603X7R333J500NT)
C305  value 33nF  [0603_cap]  (hidden comment: AIDE CAPACITOR 0603X7R333J500NT)
C306  value 33nF  [0603_cap]  (hidden comment: AIDE CAPACITOR 0603X7R333J500NT)
C307  value 33nF  [0603_cap]  (hidden comment: AIDE CAPACITOR 0603X7R333J500NT)
C308  value 33nF  [0603_cap]  (hidden comment: AIDE CAPACITOR 0603X7R333J500NT)
C309  value 33nF  [0603_cap]  (hidden comment: AIDE CAPACITOR 0603X7R333J500NT)
C310  value 33nF  [0603_cap]  (hidden comment: AIDE CAPACITOR 0603X7R333J500NT)
C311  value 33nF  [0603_cap]  (hidden comment: AIDE CAPACITOR 0603X7R333J500NT)
C312  value 33nF  [0603_cap]  (hidden comment: AIDE CAPACITOR 0603X7R333J500NT)
C313  value 33nF  [0603_cap]  (hidden comment: AIDE CAPACITOR 0603X7R333J500NT)
F300  JDTfuse JFC2410-0200TS  [FUSE-SMD_L6.1-W2.7]  (value not drawn)
F301  JDTfuse JFC2410-0200TS  [FUSE-SMD_L6.1-W2.7]  (value not drawn)
F302  JDTfuse JFC2410-0200TS  [FUSE-SMD_L6.1-W2.7]  (value not drawn)
R300  value 1kΩ  [0603_RES]  (hidden comment: FOJAN FRC0603F1001TS)
R301  value 5.1Ω  [0603_RES]  (hidden comment: SEI(Stackpole Electronics Inc.))
R302  value 5.1Ω  [0603_RES]  (hidden comment: SEI(Stackpole Electronics Inc.))
R303  value 165kΩ  [0603_RES]  (hidden comment: BOURNS CR0603-FX-1653ELF)
R304  value 165kΩ  [0603_RES]  (hidden comment: BOURNS CR0603-FX-1653ELF)
R305  value 165kΩ  [0603_RES]  (hidden comment: BOURNS CR0603-FX-1653ELF)
R306  value 165kΩ  [0603_RES]  (hidden comment: BOURNS CR0603-FX-1653ELF)
R307  value 165kΩ  [0603_RES]  (hidden comment: BOURNS CR0603-FX-1653ELF)
R308  value 165kΩ  [0603_RES]  (hidden comment: BOURNS CR0603-FX-1653ELF)
R309  value 1kΩ  [0603_RES]  (hidden comment: FOJAN FRC0603F1001TS)
R310  value 1kΩ  [0603_RES]  (hidden comment: FOJAN FRC0603F1001TS)
R311  value 1kΩ  [0603_RES]  (hidden comment: FOJAN FRC0603F1001TS)
R312  value 1kΩ  [0603_RES]  (hidden comment: FOJAN FRC0603F1001TS)
R313  value 5.1Ω  [0603_RES]  (hidden comment: SEI(Stackpole Electronics Inc.))
R314  value 165kΩ  [0603_RES]  (hidden comment: BOURNS CR0603-FX-1653ELF)
R315  value 165kΩ  [0603_RES]  (hidden comment: BOURNS CR0603-FX-1653ELF)
R316  value 165kΩ  [0603_RES]  (hidden comment: BOURNS CR0603-FX-1653ELF)
R317  value 165kΩ  [0603_RES]  (hidden comment: BOURNS CR0603-FX-1653ELF)
R318  value 165kΩ  [0603_RES]  (hidden comment: BOURNS CR0603-FX-1653ELF)
R319  value 165kΩ  [0603_RES]  (hidden comment: BOURNS CR0603-FX-1653ELF)
R320  value 1kΩ  [0603_RES]  (hidden comment: FOJAN FRC0603F1001TS)
R321  value 5.1Ω  [0603_RES]  (hidden comment: SEI(Stackpole Electronics Inc.))
R322  value 1kΩ  [0603_RES]  (hidden comment: FOJAN FRC0603F1001TS)
R323  value 1kΩ  [0603_RES]  (hidden comment: FOJAN FRC0603F1001TS)
R324  value 1kΩ  [0603_RES]  (hidden comment: FOJAN FRC0603F1001TS)
R325  value 5.1Ω  [0603_RES]  (hidden comment: SEI(Stackpole Electronics Inc.))
R326  value 165kΩ  [0603_RES]  (hidden comment: BOURNS CR0603-FX-1653ELF)
R327  value 165kΩ  [0603_RES]  (hidden comment: BOURNS CR0603-FX-1653ELF)
R328  value 165kΩ  [0603_RES]  (hidden comment: BOURNS CR0603-FX-1653ELF)
R329  value 165kΩ  [0603_RES]  (hidden comment: BOURNS CR0603-FX-1653ELF)
R330  value 165kΩ  [0603_RES]  (hidden comment: BOURNS CR0603-FX-1653ELF)
R331  value 165kΩ  [0603_RES]  (hidden comment: BOURNS CR0603-FX-1653ELF)
R332  value 1kΩ  [0603_RES]  (hidden comment: FOJAN FRC0603F1001TS)
R333  value 5.1Ω  [0603_RES]  (hidden comment: SEI(Stackpole Electronics Inc.))
R334  value 1kΩ  [0603_RES]  (hidden comment: FOJAN FRC0603F1001TS)
R335  value 1kΩ  [0603_RES]  (hidden comment: FOJAN FRC0603F1001TS)
R336  value 1kΩ  [0603_RES]  (hidden comment: FOJAN FRC0603F1001TS)
R337  value 5.1Ω  [0603_RES]  (hidden comment: SEI(Stackpole Electronics Inc.))
R338  value 5.1Ω  [0603_RES]  (hidden comment: SEI(Stackpole Electronics Inc.))
R339  value 1kΩ  [0603_RES]  (hidden comment: FOJAN FRC0603F1001TS)
RV300  MOV-14D471K  [MOV14D471K]
RV301  MOV-14D471K  [MOV14D471K]
RV302  MOV-14D471K  [MOV14D471K]
U300  hx pj-320a-3p dip  [AUDIO-SMD_HX-PJ-320A-3P-DIP]  (value not drawn)
U301  c50126v-4p0g56  [CONN-TH_C50126V-4P0G56]  (value not drawn)
U302  hx pj-320a-3p dip  [AUDIO-SMD_HX-PJ-320A-3P-DIP]  (value not drawn)
U303  hx pj-320a-3p dip  [AUDIO-SMD_HX-PJ-320A-3P-DIP]  (value not drawn)
U304  hx pj-320a-3p dip  [AUDIO-SMD_HX-PJ-320A-3P-DIP]  (value not drawn)

### Blocks framed on the sheet
Current Sensing: C300 C301 C304 C305 C308 C310 C312 C313 R300-R302 R309 R311 R313 R321 R322 R324 R325 R333 R334 R336-R339 U300 U302-U304
Voltage Divider: C302 C303 C306 C307 C309 C311 F300-F302 R303-R308 R310 R312 R314-R320 R323 R326-R332 R335 RV300-RV302 U301

### Ports
IAN (see MAIN[1C], MEASURES[1C]), IAP (see MAIN[1C], MEASURES[1C]), IBN (see MAIN[1C], MEASURES[1C]), IBP (see MAIN[1C], MEASURES[1C]), ICN (see MAIN[1C], MEASURES[1C]), ICP (see MAIN[1C], MEASURES[1C]), INN (see MAIN[1C], MEASURES[1C]), INP (see MAIN[1C], MEASURES[1C]), L3_120VAC (see MAIN[1B], POWER[1B]), VAN (see MAIN[1B], MEASURES[1C]), VAP (see MAIN[1B], MEASURES[1C]), VBN (see MAIN[1B], MEASURES[1C]), VBP (see MAIN[1B], MEASURES[1C]), VCN (see MAIN[1B], MEASURES[1C]), VCP (see MAIN[1B], MEASURES[1C])

### Nets
AGND: C300.1 C301.2 C302.1 C303.2 C304.1 C305.2 C306.1 C307.2 C308.1 C309.1 C310.2 C311.2 C312.1 C313.2 R301.1 R302.2 R310.1 R312.2 R313.1 R320.1 R321.2 R323.2 R325.1 R332.1 R333.2 R335.2 R337.1 R338.2 RV300.2 RV301.2 RV302.2 U301.4
L1_120VAC: F300.2 R303.2 RV300.1
L2_120VAC: F301.2 R314.2 RV301.1
L3_120VAC: F302.2 R326.2 RV302.1 ; port L3_120VAC
NetC300_2: C300.2 R300.1 ; port IAP
NetC301_1: C301.1 R309.1 ; port IAN
NetC302_2: C302.2 R308.1 R310.2 ; port VAP
NetC303_1: C303.1 R312.1 ; port VAN
NetC304_2: C304.2 R311.1 ; port IBP
NetC305_1: C305.1 R322.1 ; port IBN
NetC306_2: C306.2 R319.1 R320.2 ; port VBP
NetC307_1: C307.1 R323.1 ; port VBN
NetC308_2: C308.2 R324.1 ; port ICP
NetC309_2: C309.2 R331.1 R332.2 ; port VCP
NetC310_1: C310.1 R334.1 ; port ICN
NetC311_1: C311.1 R335.1 ; port VCN
NetC312_2: C312.2 R336.1 ; port INP
NetC313_1: C313.1 R339.1 ; port INN
NetF300_1: F300.1 U301.1
NetF301_1: F301.1 U301.2
NetF302_1: F302.1 U301.3
NetR300_2: R300.2 R301.2 U300.4
NetR302_1: R302.1 R309.2 U300.2
NetR303_1: R303.1 R304.2
NetR304_1: R304.1 R305.2
NetR305_1: R305.1 R306.2
NetR306_1: R306.1 R307.2
NetR307_1: R307.1 R308.2
NetR311_2: R311.2 R313.2 U302.4
NetR314_1: R314.1 R315.2
NetR315_1: R315.1 R316.2
NetR316_1: R316.1 R317.2
NetR317_1: R317.1 R318.2
NetR318_1: R318.1 R319.2
NetR321_1: R321.1 R322.2 U302.2
NetR324_2: R324.2 R325.2 U303.4
NetR326_1: R326.1 R327.2
NetR327_1: R327.1 R328.2
NetR328_1: R328.1 R329.2
NetR329_1: R329.1 R330.2
NetR330_1: R330.1 R331.2
NetR333_1: R333.1 R334.2 U303.2
NetR336_2: R336.2 R337.2 U304.4
NetR338_1: R338.1 R339.2 U304.2

Not connected (* = marked no-connect by the designer): U300 3; U302 3; U303 3; U304 3

### Notes on the sheet
- N_AC

### Library data of the parts
C300-C313 = CAP_CER_33nF X7R ±5% 50V: 33nF X7R ±5% 50V 0603 Ceramic Capacitors RoHS; ComponentLink1Description: LCSC; ComponentLink1URL: https://www.lcsc.com/product-detail/C49326639.html?s_z=n_q_AIDE%2520CAPACITOR%25200603X7R333J500NT&spm=wm.fly.bg.0.xh&lcsc_vid=FFRdVwAETgNbVwAHTlRdV1UFEwcIU1ZXQVZZAlYFQAcxVlNfRlJdU1VSRlReXjsOAxUeFF5JWBYZEEoKFBINSQcJGk4LFEsFFhULAAsUDk5fVl1fWQkaCgg%3D; Supplier 1: LCSC; Manufacturer 1: AIDE CAPACITOR; Manufacturer Part Number 1: 0603X7R333J500NT; Supplier Part Number 1: C49326639
F300-F302 = FUSE_MOV_JFC2410: Surface Mount Fuse 200mA 250V 2410 Fuses; ComponentLink1Description: LCSC; ComponentLink1URL: https://www.lcsc.com/product-detail/C55058769.html?s_z=n_q_JFC2410-0200TS; Supplier 1: LCSC; Supplier Part Number 1: C55058769; Manufacturer 1: JDTfuse; Manufacturer Part Number 1: JFC2410-0200TS
R300 R309-R312 R320 R322-R324 R332 R334-R336 R339 = RES 1kohms ±1% 100mW 0603: RES 1kΩ ±1% 100mW 0603; ComponentLink1Description: New link; ComponentLink1URL: https://www.lcsc.com/es/product-detail/C2907002.html?spm=wm.fly.bg.1.xh___wm.fly.dhl.mly.13-6-1&lcsc_vid=T1EMUlBeR1ALUlVSFANeUFcFR1BWV1EHFVFaA1dQElAxVlNfRlJaV1FUQldbXzsOAxUeFF5JWBYZEEoKFBINSQcJGk4NBhYS; Supplier 1: LCSC; Supplier Part Number 1: C2907002; Manufacturer Part Number 1: FRC0603F1001TS; Manufacturer 1: FOJAN
R301 R302 R313 R321 R325 R333 R337 R338 = RES 5.1ohms ±1% 400mW 0603: RES 5.1Ω ±1% 400mW 0603; Manufacturer 1: UNI-ROYAL HQ03W5F510KT5E; Manufacturer Part Number 1: HQ03W5F510KT5E; Supplier Part Number 1: C2791987; Supplier 1: LCSC; ComponentLink1Description: New link; ComponentLink1URL: https://www.lcsc.com/es/product-detail/C2907011.html?spm=wm.fly.bg.0.xh___wm.fly.tp.1.ml&lcsc_vid=TlUKUVJeQVYNVVcAFQBcBQJfRlgPUVYCQllYVwUHEQcxVlNfRFRfUVJUQ1JcXzsOAxUeFF5JWBYZEEoKFBINSQcJGk4LFEs%3D
R303-R308 R314-R319 R326-R331 = RES 165k ±0.1% 100mW 0603: RES 165kΩ ±0.1% 100mW 0603; Manufacturer 1: YAGEO; Manufacturer Part Number 1: RT0603BRD07165KL; ComponentLink1Description: New link; ComponentLink1URL: https://www.lcsc.com/product-detail/C861150.html; Supplier Part Number 1: C861150; Supplier 1: LCSC
RV300-RV302 = MOV-14D471K: 470 V 4.5 kA Varistor 1 Circuit Through Hole Disc 14mm; Manufacturer 1: BOURNS; ComponentLink1Description: LCSC; ComponentLink1URL: https://www.lcsc.com/es/product-detail/C1527439.html?s_z=n_q_MOV-14D471K&spm=wm.fly.bg.0.xh&lcsc_vid=FFRdVwAETgNbVwAHTlRdV1UFEwcIU1ZXQVZZAlYFQAcxVlNfRlJdUlZRQlZXVjsOAxUeFF5JWBYZEEoKFBINSQcJGk4LFEsWBQ4KEgcSWgULEwUPG04tUlNXRlhYSQwSGg0%3D; Supplier 1: LCSC; Supplier Part Number 1: C1527439; ComponentLink2Description: Datasheet; ComponentLink2URL: https://www.lcsc.com/datasheet/C1527439.pdf; Manufacturer Part Number 1: MOV-14D471K
U300 U302-U304 = hx pj-320a-3p dip: Connector Type:3.5mm Headphone Jack Current Rating:500mA Voltage Rating (Max):30V Operating Temperature:-30℃~+70℃ Operating Temperature:-30℃~+70℃ Rank Number:TRS Mounting Style:Right-Angle Body Height:5mm Length:14.1mm Width:6mm; Manufacturer 1: hanxia; ComponentLink1Description: LCSC; ComponentLink1URL: https://www.lcsc.com/product-detail/C19189087.html?s_z=n_q_hx%2520pj-320a-3p%2520dip; Supplier 1: LCSC; Supplier Part Number 1: C19189087; Manufacturer Part Number 1: HX PJ-320A-3P DIP
U301 = BR_50126v-4p0g56: Number of Positions or Pins:1x4P Pitch:5mm Color:Green Mounting Type:Through Hole Number of Pins:4P Number of Rows:1 Number of PINs Per Row:4 Current Rating:18A Voltage Rating (Max):250V Wire Gauge - AWG:14~26 Wire Gauge - mm2:0.5~2.5 Wire Gauge - mm2:0.5; Manufacturer 1: JXTCONN; Color: Green; ComponentLink1Description: LCSC; ComponentLink1URL: https://www.lcsc.com/es/product-detail/C49291885.html?spm=wm.fly.bg.2.xh&lcsc_vid=QARXAVUEQ1ELXl1fE1ZXXgVfFgdaUV1TRAUKVFNRFFAxVlNfRlVdU1NQQFdcUTtW; Supplier 1: LCSC; Supplier Part Number 1: C49291885; Manufacturer Part Number 1: C50126V-4P0G56

## Sheet MCU.SchDoc
size A4; SheetNumber: 5; SheetTotal: 6
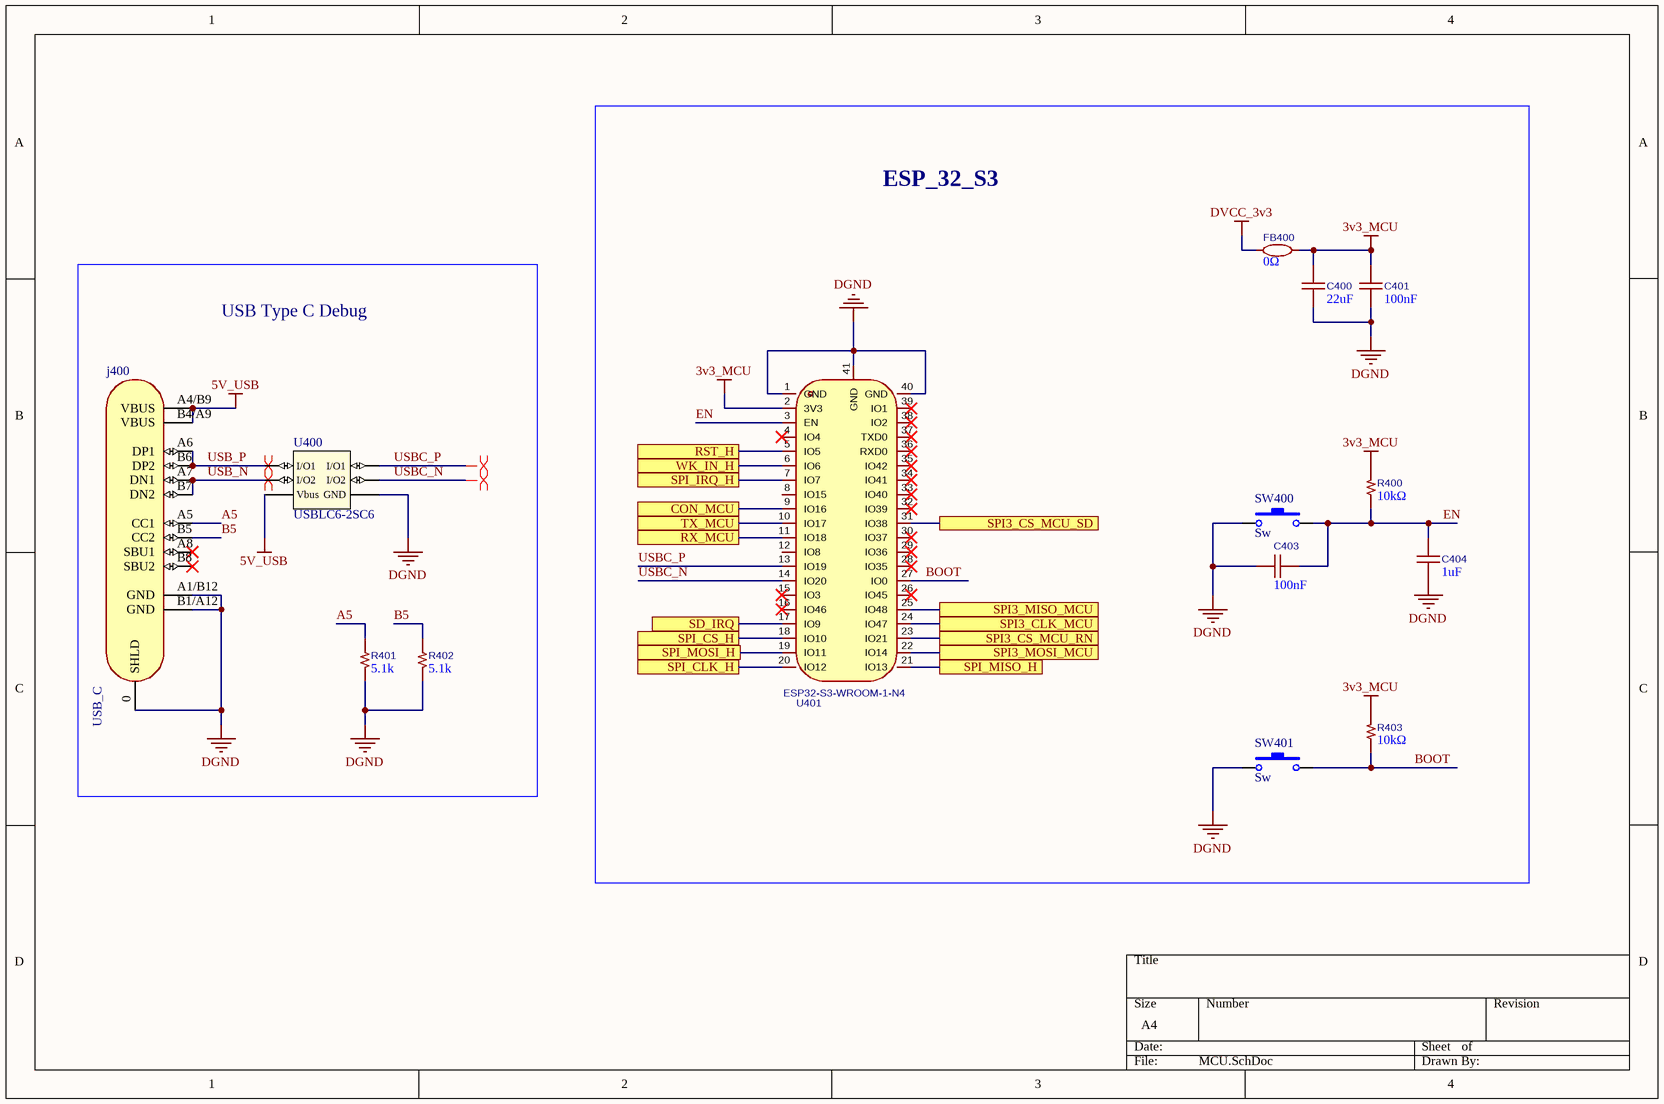
[diagram p4: MCU.SchDoc]

### Parts
C400  value 22uF  [0805_cap]  (hidden comment: Chinocera HGC0805R5226K100NSLJ)
C401  value 100nF  [0603_cap]  (hidden comment: AIDE CAPACITOR 0603X7R104K250NT)
C403  value 100nF  [0603_cap]  (hidden comment: AIDE CAPACITOR 0603X7R104K250NT)
C404  value 1uF  [0603_cap]  (hidden comment: CL10B105KB8NQNC)
FB400  value 0Ω  [0603_cap]  (hidden comment: Yanchuang SCBM160808U090T)
j400  value USB_C  [CON_USB_C_16P_RA]  (hidden comment: USB C)
R400  value 10kΩ  [0603_RES]  (hidden comment: SAE 1RC0603F1002)
R401  value 5.1k  [0603_RES]  (hidden comment: UNI-ROYAL HP05W3F100JT5E)
R402  value 5.1k  [0603_RES]  (hidden comment: UNI-ROYAL HP05W3F100JT5E)
R403  value 10kΩ  [0603_RES]  (hidden comment: SAE 1RC0603F1002)
SW400  Sw  [Sw_PUSH_4.5x4.5x5mm]
SW401  Sw  [Sw_PUSH_4.5x4.5x5mm]
U400  USBLC6-2SC6  [SOT_23_6]
U401  esp32-s3-wroom-1-n4  [WIFIM-SMD_ESP32-S3-WROOM-1-N8]

### Blocks framed on the sheet
ESP_32_S3: C400 C401 C403 C404 FB400 R400 R403 SW400 SW401 U401
USB Type C Debug: j400 R401 R402 U400

### Ports
CON_MCU (see MAIN[3B], INTERFACES[1A]), RST_H (see MAIN[3B], INTERFACES[1C]), RX_MCU (see MAIN[3B], INTERFACES[1A]), SD_IRQ (see MAIN[3B], INTERFACES[3C]), SPI3_CLK_MCU (see MAIN[2B], MEASURES[4C]), SPI3_CS_MCU_RN (see MAIN[2B], MEASURES[4C]), SPI3_CS_MCU_SD (see MAIN[3B], INTERFACES[3B]), SPI3_MISO_MCU (see MAIN[2B], MEASURES[4C]), SPI3_MOSI_MCU (see MAIN[2B], MEASURES[4C]), SPI_CLK_H (see MAIN[3B], INTERFACES[1D]), SPI_CS_H (see MAIN[3B], INTERFACES[1C]), SPI_IRQ_H (see MAIN[3B], INTERFACES[1C]), SPI_MISO_H (see MAIN[3B], INTERFACES[1D]), SPI_MOSI_H (see MAIN[3B], INTERFACES[1D]), TX_MCU (see MAIN[3B], INTERFACES[1B]), WK_IN_H (see MAIN[3B], INTERFACES[1C])

### Nets
3v3_MCU: C400.2 C401.2 FB400.1 R400.2 R403.2 U401.2(3V3)
5V_USB: j400.A4/B9(VBUS) j400.B4/A9(VBUS) U400.5(Vbus)
DGND: C400.1 C401.1 C403.2 C404.1 j400.0(SHLD) j400.A1/B12(GND) j400.B1/A12(GND) R401.2 R402.2 SW400.1 SW401.1 U400.2(GND) U401.1(GND) U401.40(GND) U401.41(GND)
DVCC_3v3: FB400.2
A5: j400.A5(CC1) R401.1
B5: j400.B5(CC2) R402.1
BOOT: R403.1 SW401.2 U401.27(IO0)
EN: C403.1 C404.2 R400.1 SW400.2 U401.3(EN)
SPI_CLK_H: U401.20(IO12) ; port SPI_CLK_H
SPI_MISO_H: U401.21(IO13) ; port SPI_MISO_H
SPI_MOSI_H: U401.19(IO11) ; port SPI_MOSI_H
USB_N: j400.A7(DN1) j400.B7(DN2) U400.4(I/O2)
USB_P: j400.A6(DP1) j400.B6(DP2) U400.6(I/O1)
USBC_N: U400.3(I/O2) U401.14(IO20)
USBC_P: U400.1(I/O1) U401.13(IO19)
Net500_1: U401.5(IO5) ; port RST_H
Net500_2: U401.6(IO6) ; port WK_IN_H
Net500_3: U401.7(IO7) ; port SPI_IRQ_H
Net500_4: U401.18(IO10) ; port SPI_CS_H
NetR500_2: U401.9(IO16) ; port CON_MCU
NetR503_1: U401.31(IO38) ; port SPI3_CS_MCU_SD
NetR507_2: U401.17(IO9) ; port SD_IRQ
NetU101_3: U401.22(IO14) ; port SPI3_MOSI_MCU
NetU101_4: U401.23(IO21) ; port SPI3_CS_MCU_RN
NetU101_5: U401.24(IO47) ; port SPI3_CLK_MCU
NetU101_6: U401.25(IO48) ; port SPI3_MISO_MCU
NetU401_10: U401.10(IO17) ; port TX_MCU
NetU401_11: U401.11(IO18) ; port RX_MCU

Not connected (* = marked no-connect by the designer): j400 A8(SBU1)* B8(SBU2)*; U401 4(IO4)* 8(IO15) 12(IO8) 15(IO3)* 16(IO46)* 26(IO45)* 28(IO35)* 29(IO36)* 30(IO37)* 32(IO39)* 33(IO40)* 34(IO41)* 35(IO42)* 36(RXD0)* 37(TXD0)* 38(IO2)* 39(IO1)*

### Layout directives
differential pair: USB_N, USB_P, USBC_N, USBC_P

### Library data of the parts
C400 = CAP CER 22uF 10V X5R 0805: ComponentLink1Description: LCSC; ComponentLink1URL: https://www.lcsc.com/es/product-detail/C7432777.html?spm=wm.fly.bg.4.xh___wm.fly.dhl.mly.13-0-3&lcsc_vid=ElBYBFACR1JaVQdSQ1NeBFwHFAdfUFIFEwUNXlwCEVQxVlNfRlVWUFNWT1hWUDtW; Supplier 1: LCSC; Manufacturer 1: Chinocera; Manufacturer Part Number 1: HGC0805R5226K100NSLJ; Supplier Part Number 1: C7432777
C401 C403 = CAP CER 100nF 25V X7R 0603: ComponentLink1Description: LCSC; ComponentLink1URL: https://www.lcsc.com/product-detail/C465156.html?s_z=n_q_HGC0603G0150J500NTHJ; Supplier 1: LCSC; Manufacturer 1: AIDE CAPACITOR; Manufacturer Part Number 1: 0603X7R104K250NT; Supplier Part Number 1: C48579280
C404 = CAP CER 1uF 50V X7R 0603: as C101 on sheet MEASURES; ComponentLink1Description: LCSC; ComponentLink1URL: https://www.lcsc.com/es/product-detail/C5199872.html?spm=wm.fly.bg.9.xh&lcsc_vid=ElBYBFACR1JaVQdSQ1NeBFwHFAdfUFIFEwUNXlwCEVQxVlNfRlVWUFNWT1hWUDtW; Manufacturer Part Number 1: CL10B105KB8NQNC; Supplier 1: LSCS; Supplier Part Number 1: C5199872
FB400 = FERR_10mohms 15o@100MHz: as FB100 on sheet MEASURES; ComponentLink1Description: LCSC; ComponentLink1URL: https://www.lcsc.com/es/product-detail/C52205324.html?s_z=s_c_Ferrite%2520Beads%2520and%2520Chips&spm=wm.fly.bg.0.xh&lcsc_vid=T1EMUlBeR1ALUlVSFANeUFcFR1BWV1EHFVFaA1dQElAxVlNfRlJaVFNSQlhYUjsOAxUeFF5JWBYZEEoKFBINSQcJGk4LFEsFFhULAAsUDk5fVlNWWQkaCgg%3D; Supplier 1: LCSC; Supplier Part Number 1: C52205324; Manufacturer 1: Yanchuang; Manufacturer Part Number 1: SCBM160808U090T
j400 = CON_USB_TYPEC_16P: 3A USB 3.1 1 Surface Mount 16P Female -40℃~+85℃ Type-C SMD USB Connectors ROHS; Manufacturer 1: SHOU HAN; Manufacturer Part Number 1: TYPE-C-3.1-16PIN; Supplier 1: LCSC; Supplier Part Number 1: C7507405; ComponentLink1Description: LCSC; ComponentLink1URL: https://lcsc.com/product-detail/USB-Connectors_SHOU-HAN-TYPE-C-3-1-16PIN_C7507405.html
R400 R403 = RES_10kohms 100mW 75V: as R100 on sheet MEASURES; ComponentLink1Description: New link; ComponentLink1URL: https://www.lcsc.com/es/product-detail/C53224186.html?spm=wm.fly.bg.4.xh___wm.fly.dhl.mly.13-6-1&lcsc_vid=T1EMUlBeR1ALUlVSFANeUFcFR1BWV1EHFVFaA1dQElAxVlNfRlJaV1FUQldbXzsOAxUeFF5JWBYZEEoKFBINSQcJGk4NBhYS; Manufacturer 1: SAE; Manufacturer Part Number 1: 1RC0603F1002; Supplier Part Number 1: C53224186; Supplier 1: LCSC
R401 R402 = RES 5.1Kohms ±1% 100mW 0603_1: 5.11kΩ 100mW 50V Thick Film Resistor ±1% ±100ppm/℃ 0603 Chip Resistor - Surface Mount; Manufacturer 1: HWA CHN; Manufacturer Part Number 1: HRC0603F5111ENTN; ComponentLink1Description: New link; ComponentLink1URL: https://www.lcsc.com/product-detail/C55098456.html; Supplier Part Number 1: C55098456; Supplier 1: LCSC
SW400 SW401 = Sw_PUSH_4.5x4.5x5.0xmm: SWITCH TACTILE SPST-NO 0.05A 12V; Manufacturer: BZCN; Manufacturer Part Number: TSC015A05026A; Supplier 1: LCSC; Supplier Part Number 1: C2888509; Last modified by: N-A.Potosi; Last modified date: 20190222; ComponentLink1Description: LCSC; ComponentLink1URL: https://www.lcsc.com/product-detail/Tactile-Switches_BZCN-TSC015A05026A_C2888509.html
U400 = TVS_5.25V_2CH_SOT_23_6: TVS DIODE 5.25V 17V SOT23-6; Manufacturer 1: STMicroelectronics; ComponentLink1Description: LCSC; ComponentLink1URL: https://www.lcsc.com/product-detail/ESD-Protection-Devices_STMicroelectronics-USBLC6-2SC6_C7519.html; Supplier 1: LCSC; Supplier Part Number 1: C7519; Manufacturer Part Number 1: USBLC6-2SC6
U401 = esp32-s3-wroom-1-n4: Utilized IC / Part:ESP32-S3 Wireless Standard:Bluetooth5.0 Interface Type:I2C；GPIO；UART；SPI；USB；I2S Frequency:2.4GHz Antenna Type:On-board PCB Antenna Output Power:20.5dBm Output Power:20.5dBm Voltage - Supply:3V~3.6V Voltage - Supply:3V~3.6V Receive  Cur; Manufacturer 1: ESPRESSIF; Symbol: ESP32-S3-WROOM-1-N4; Operating Temperature: -40℃~+85℃; ComponentLink1Description: LCSC; ComponentLink1URL: https://www.lcsc.com/product-detail/C2913197.html?s_z=h_q_esp32-s3-wroom-1-n4; Supplier 1: LCSC; Supplier Part Number 1: C2913197; Manufacturer Part Number 1: ESP32-S3-WROOM-1-N4

## Sheet INTERFACES.SchDoc
size A4; SheetNumber: 6; SheetTotal: 6
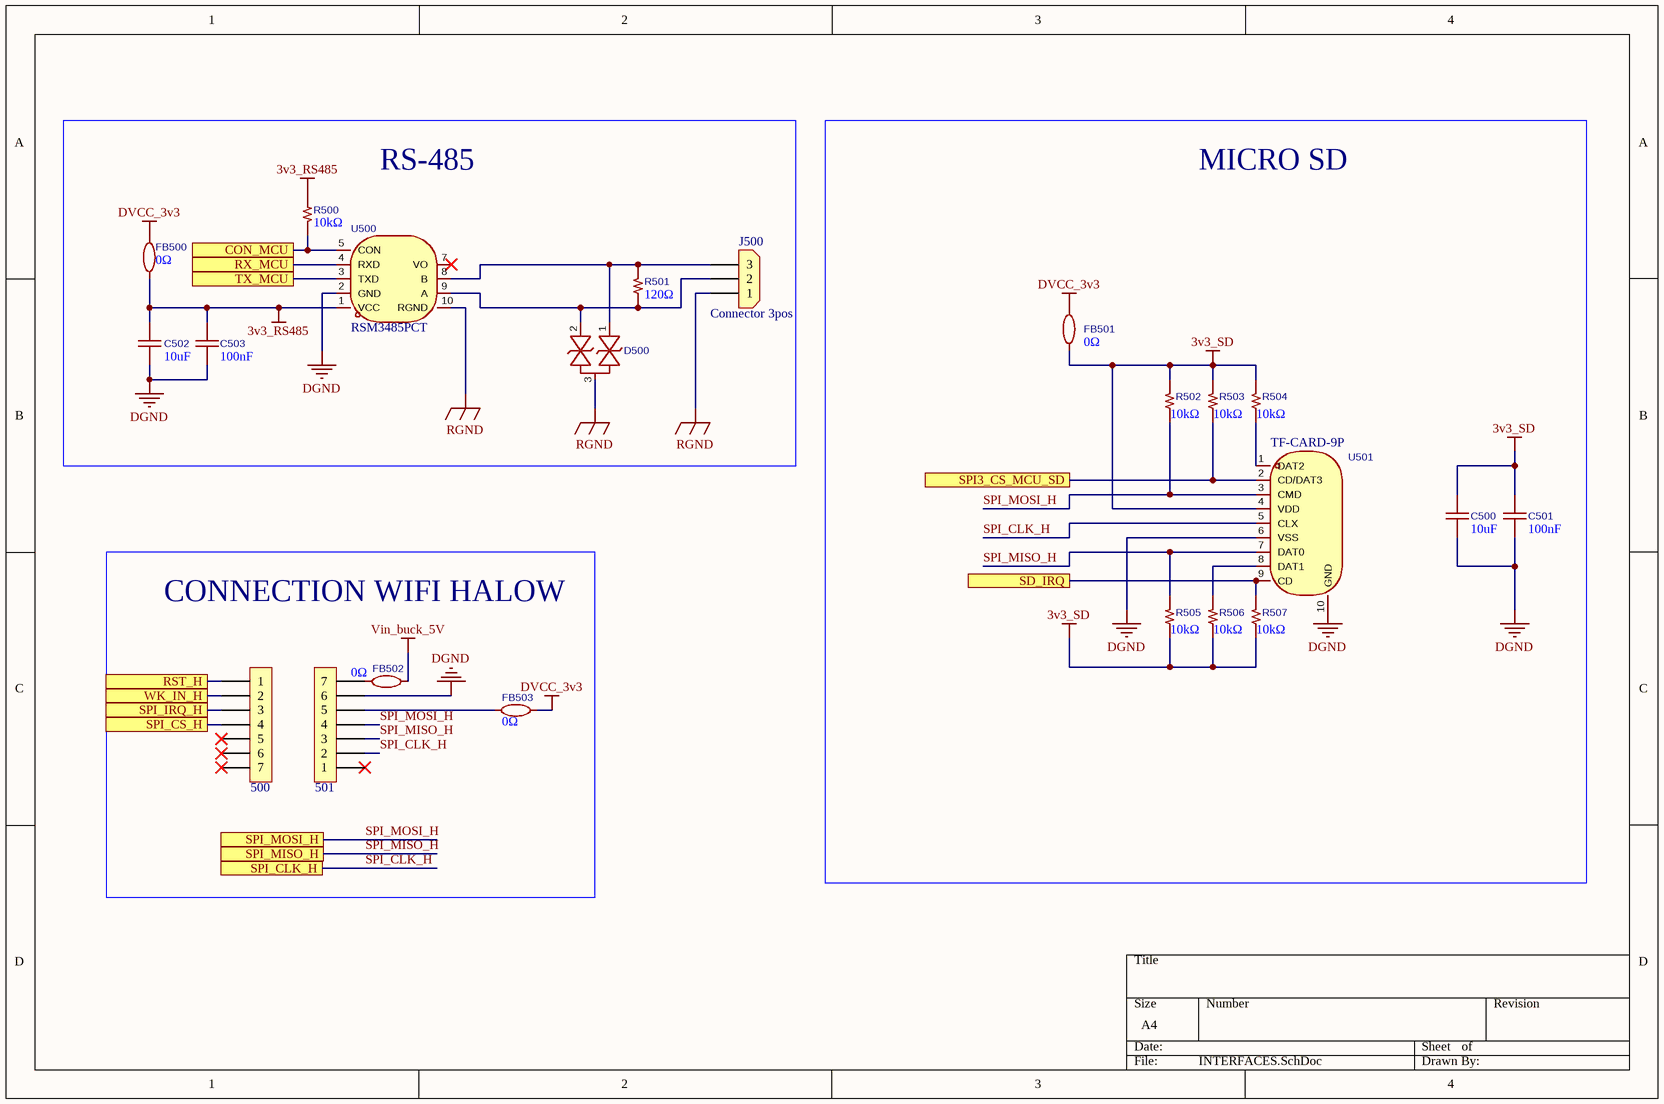
[diagram p5: INTERFACES.SchDoc]

### Parts
500  7x1  [H_7x1_TH_100mil]  (value not drawn)  (no BOM)
501  7x1  [H_7x1_TH_100mil]  (value not drawn)  (no BOM)
C500  value 10uF  [0805_cap]  (hidden comment: muRata GRM21BR61C106KE15L)
C501  value 100nF  [0603_cap]  (hidden comment: AIDE CAPACITOR 0603X7R104K250NT)
C502  value 10uF  [0805_cap]  (hidden comment: muRata GRM21BR61C106KE15L)
C503  value 100nF  [0603_cap]  (hidden comment: AIDE CAPACITOR 0603X7R104K250NT)
D500  C908219  [SOT-23-3_L2.9-W1.3-P1.90-LS2.4-BR]  (value not drawn)
FB500  value 0Ω  [0603_cap]  (hidden comment: Yanchuang SCBM160808U090T)
FB501  value 0Ω  [0603_cap]  (hidden comment: Yanchuang SCBM160808U090T)
FB502  value 0Ω  [0603_cap]  (hidden comment: Yanchuang SCBM160808U090T)
FB503  value 0Ω  [0603_cap]  (hidden comment: Yanchuang SCBM160808U090T)
J500  Connector 3pos  [CON_3x1_TH_5mm]
R500  value 10kΩ  [0603_RES]  (hidden comment: SAE 1RC0603F1002)
R501  value 120Ω  [0603_RES]  (hidden comment: RES 120Ω ±1% 100mW 0603)
R502  value 10kΩ  [0603_RES]  (hidden comment: SAE 1RC0603F1002)
R503  value 10kΩ  [0603_RES]  (hidden comment: SAE 1RC0603F1002)
R504  value 10kΩ  [0603_RES]  (hidden comment: SAE 1RC0603F1002)
R505  value 10kΩ  [0603_RES]  (hidden comment: SAE 1RC0603F1002)
R506  value 10kΩ  [0603_RES]  (hidden comment: SAE 1RC0603F1002)
R507  value 10kΩ  [0603_RES]  (hidden comment: SAE 1RC0603F1002)
U500  rsm3485pct  [COMM-TH_RSM3485PCT]
U501  tf-card-9p  [SIM-SMD_LX_XDFP-0090-012]

### Blocks framed on the sheet
RS-485: C502 C503 D500 FB500 J500 R500 R501 U500
MICRO SD: C500 C501 FB501 R502-R507 U501
CONNECTION WIFI HALOW: 500 501 FB502 FB503

### Ports
CON_MCU (see MAIN[3B], MCU[2B]), RST_H (see MAIN[3B], MCU[2B]), RX_MCU (see MAIN[3B], MCU[2B]), SD_IRQ (see MAIN[3B], MCU[2C]), SPI3_CS_MCU_SD (see MAIN[3C], MCU[3B]), SPI_CLK_H (see MAIN[3B], MCU[2C]), SPI_CS_H (see MAIN[3B], MCU[2C]), SPI_IRQ_H (see MAIN[3C], MCU[2B]), SPI_MISO_H (see MAIN[3B], MCU[3C]), SPI_MOSI_H (see MAIN[3B], MCU[2C]), TX_MCU (see MAIN[3B], MCU[2B]), WK_IN_H (see MAIN[3B], MCU[2B])

### Nets
3v3_RS485: C502.2 C503.2 FB500.1 R500.1 U500.1(VCC)
3v3_SD: C500.2 C501.2 FB501.1 R502.2 R503.2 R504.2 R505.1 R506.1 R507.1 U501.4(VDD)
DGND: 501.6 C500.1 C501.1 C502.1 C503.1 U500.2(GND) U501.6(VSS) U501.10(GND)
DVCC_3v3: FB500.2 FB501.2 FB503.1
RGND: D500.3 J500.1 U500.10(RGND)
Vin_buck_5V: FB502.1
SPI_CLK_H: 501.2 U501.5(CLX) ; port SPI_CLK_H
SPI_MISO_H: 501.3 R505.2 U501.7(DAT0) ; port SPI_MISO_H
SPI_MOSI_H: 501.4 R502.1 U501.3(CMD) ; port SPI_MOSI_H
Net500_1: 500.1 ; port RST_H
Net500_2: 500.2 ; port WK_IN_H
Net500_3: 500.3 ; port SPI_IRQ_H
Net500_4: 500.4 ; port SPI_CS_H
Net501_5: 501.5 FB503.2
Net501_7: 501.7 FB502.2
NetD500_1: D500.1 J500.3 R501.2 U500.8(B)
NetD500_2: D500.2 J500.2 R501.1 U500.9(A)
NetR500_2: R500.2 U500.5(CON) ; port CON_MCU
NetR503_1: R503.1 U501.2(CD/DAT3) ; port SPI3_CS_MCU_SD
NetR504_1: R504.1 U501.1(DAT2)
NetR506_2: R506.2 U501.8(DAT1)
NetR507_2: R507.2 U501.9(CD) ; port SD_IRQ
NetU401_10: U500.3(TXD) ; port TX_MCU
NetU401_11: U500.4(RXD) ; port RX_MCU

Not connected (* = marked no-connect by the designer): 500 5* 6* 7*; 501 1*; U500 7(VO)*

### Library data of the parts
500 501 = H_Male_7x1_TH_100mil: ComponentLink1Description: LCSC
C500 C502 = CAP CER 10uF 16V X5R 0805: ComponentLink1Description: New link; ComponentLink1URL: https://www.lcsc.com/es/product-detail/C77075.html?spm=wm.fly.bg.11.xh___wm.fly.dhl.mly.13-0-3&lcsc_vid=ElBYBFACR1JaVQdSQ1NeBFwHFAdfUFIFEwUNXlwCEVQxVlNfRlVWUFNWT1hWUDtW; Manufacturer 1: muRata; Manufacturer Part Number 1: GRM21BR61C106KE15L; Supplier Part Number 1: C77075; Supplier 1: LCSC
C501 C503 = CAP CER 100nF 25V X7R 0603: ComponentLink1Description: LCSC; ComponentLink1URL: https://www.lcsc.com/product-detail/C465156.html?s_z=n_q_HGC0603G0150J500NTHJ; Supplier 1: LCSC; Manufacturer 1: AIDE CAPACITOR; Manufacturer Part Number 1: 0603X7R104K250NT; Supplier Part Number 1: C48579280
D500 = sm712_c908219_RS485: Polarity:Bidirectional Reverse Stand-Off Voltage (Vrwm):7V Clamping Voltage:20V Peak Pulse Current (Ipp):18A Peak Pulse Power Dissipation (Ppp):360W Voltage - Breakdown:13.3V Reverse Leakage Current (Ir):1uA Number of Channels:2 Operating Temperature:-55℃; Manufacturer 1: FUXINSEMI; Manufacturer Part Number 1: SM712; ComponentLink1Description: New link; ComponentLink1URL: https://www.lcsc.com/es/product-detail/C908219.html?s_z=n_q_p_sm712_c908219&spm=wm.ssy.bg.0.xh&lcsc_vid=FFRdVwAETgNbVwAHTlRdV1UFEwcIU1ZXQVZZAlYFQAcxVlNfRlJdUlJTQlRWXjsOAxUeFF5JWBYZEEoKFBINSQcJGk4LFEsWBQ4KEgcSWgULEwUPG04tVVZVT1BdXlVIHxUDCw%3D%3D; Supplier Part Number 1: C908219; Supplier 1: LCSC
FB500-FB503 = FERR_10mohms 15o@100MHz: as FB100 on sheet MEASURES; ComponentLink1Description: LCSC; ComponentLink1URL: https://www.lcsc.com/es/product-detail/C52205324.html?s_z=s_c_Ferrite%2520Beads%2520and%2520Chips&spm=wm.fly.bg.0.xh&lcsc_vid=T1EMUlBeR1ALUlVSFANeUFcFR1BWV1EHFVFaA1dQElAxVlNfRlJaVFNSQlhYUjsOAxUeFF5JWBYZEEoKFBINSQcJGk4LFEsFFhULAAsUDk5fVlNWWQkaCgg%3D; Supplier 1: LCSC; Supplier Part Number 1: C52205324; Manufacturer 1: Yanchuang; Manufacturer Part Number 1: SCBM160808U090T
J500 = Con_3x1_TH_5mm: 1x3P 10A -40℃~+105℃ 300V Green 14~26 Through Hole 5mm 2.5 1 3 Plugin,P=5mm Screw Terminal Blocks ROHS; Manufacturer 1: MAX; Manufacturer Part Number 1: MX126-5.0-03P-GN01-Cu-S-A; Supplier 1: LCSC; Supplier Part Number 1: C5188435; ComponentLink1Description: Digi-Key; ComponentLink1URL: https://lcsc.com/product-detail/Screw-Terminal-Blocks_MAX-MX126-5-0-03P-GN01-Cu-S-A_C5188435.html
R500 R502-R507 = RES_10kohms 100mW 75V: as R100 on sheet MEASURES; ComponentLink1Description: New link; ComponentLink1URL: https://www.lcsc.com/es/product-detail/C53224186.html?spm=wm.fly.bg.4.xh___wm.fly.dhl.mly.13-6-1&lcsc_vid=T1EMUlBeR1ALUlVSFANeUFcFR1BWV1EHFVFaA1dQElAxVlNfRlJaV1FUQldbXzsOAxUeFF5JWBYZEEoKFBINSQcJGk4NBhYS; Manufacturer 1: SAE; Manufacturer Part Number 1: 1RC0603F1002; Supplier Part Number 1: C53224186; Supplier 1: LCSC
R501 = RES 120ohms 100mW150V Thick Film Resistor  ±100ppm 0805: as R204 on sheet POWER; ComponentLink1Description: New link; ComponentLink1URL: https://www.lcsc.com/product-detail/C48996813.html; Supplier Part Number 1: C54921099; Supplier 1: LCSC
U500 = RS485_RSM3485PCT: Data Rate:9.6Kbps ESD Protect:Yes Voltage - Supply:3.15V~3.45V Voltage - Supply:3.15V~3.45V isolation:2500V Number of Nodes:64 Quiescent Current:30mA Automatic flow control:No Operating Temperature:-40℃~+85℃ Operating Temperature:-40℃~+85℃; Manufacturer 1: VISOM; ComponentLink1Description: LCSC; ComponentLink1URL: https://www.lcsc.com/es/product-detail/C882105.html?s_z=n_q_RSM3485PCT&spm=wm.fly.bg.0.xh&lcsc_vid=T1EMUlBeR1ALUlVSFANeUFcFR1BWV1EHFVFaA1dQElAxVlNfRlJbVlVWR1RZVzsOAxUeFF5JWBYZEEoKFBINSQcJGk4LFEsFFhULAAsUDk5cUVFIHxUDCw%3D%3D; Supplier 1: LCSC; Supplier Part Number 1: C882105; Manufacturer Part Number 1: RSM3485PCT
U501 = tf-card-9p: Card Connection Mode:Push-Push Card Type:MicroSD Card (TF Card) Connector Type:Connector and Ejector Height Above Board:1.8mm Operating Temperature:-25℃~+90℃ Operating Temperature:-25℃~+90℃; Manufacturer 1: BXCONN; ComponentLink1Description: LCSC; ComponentLink1URL: https://www.lcsc.com/es/product-detail/C53144700.html?s_z=n_q_tf-card-9p&spm=wm.fly.bg.0.xh&lcsc_vid=FFRdVwAETgNbVwAHTlRdV1UFEwcIU1ZXQVZZAlYFQAcxVlNfRlJdUlNWQ1NWXjsOAxUeFF5JWBYZEEoKFBINSQcJGk4LFEsWBQ4KEgcSWgULEwUPG04tXlReRVBXSQwSGg0%3D; Supplier 1: LCSC; Supplier Part Number 1: C53144700; Manufacturer Part Number 1: TF-CARD-9P